# Altium project Studio_Clock_hv1.PrjPcb (part 2 of 3)

## Sheet Clock_7Segment.SchDoc
size A3; SheetNumber: 8; SheetTotal: 16
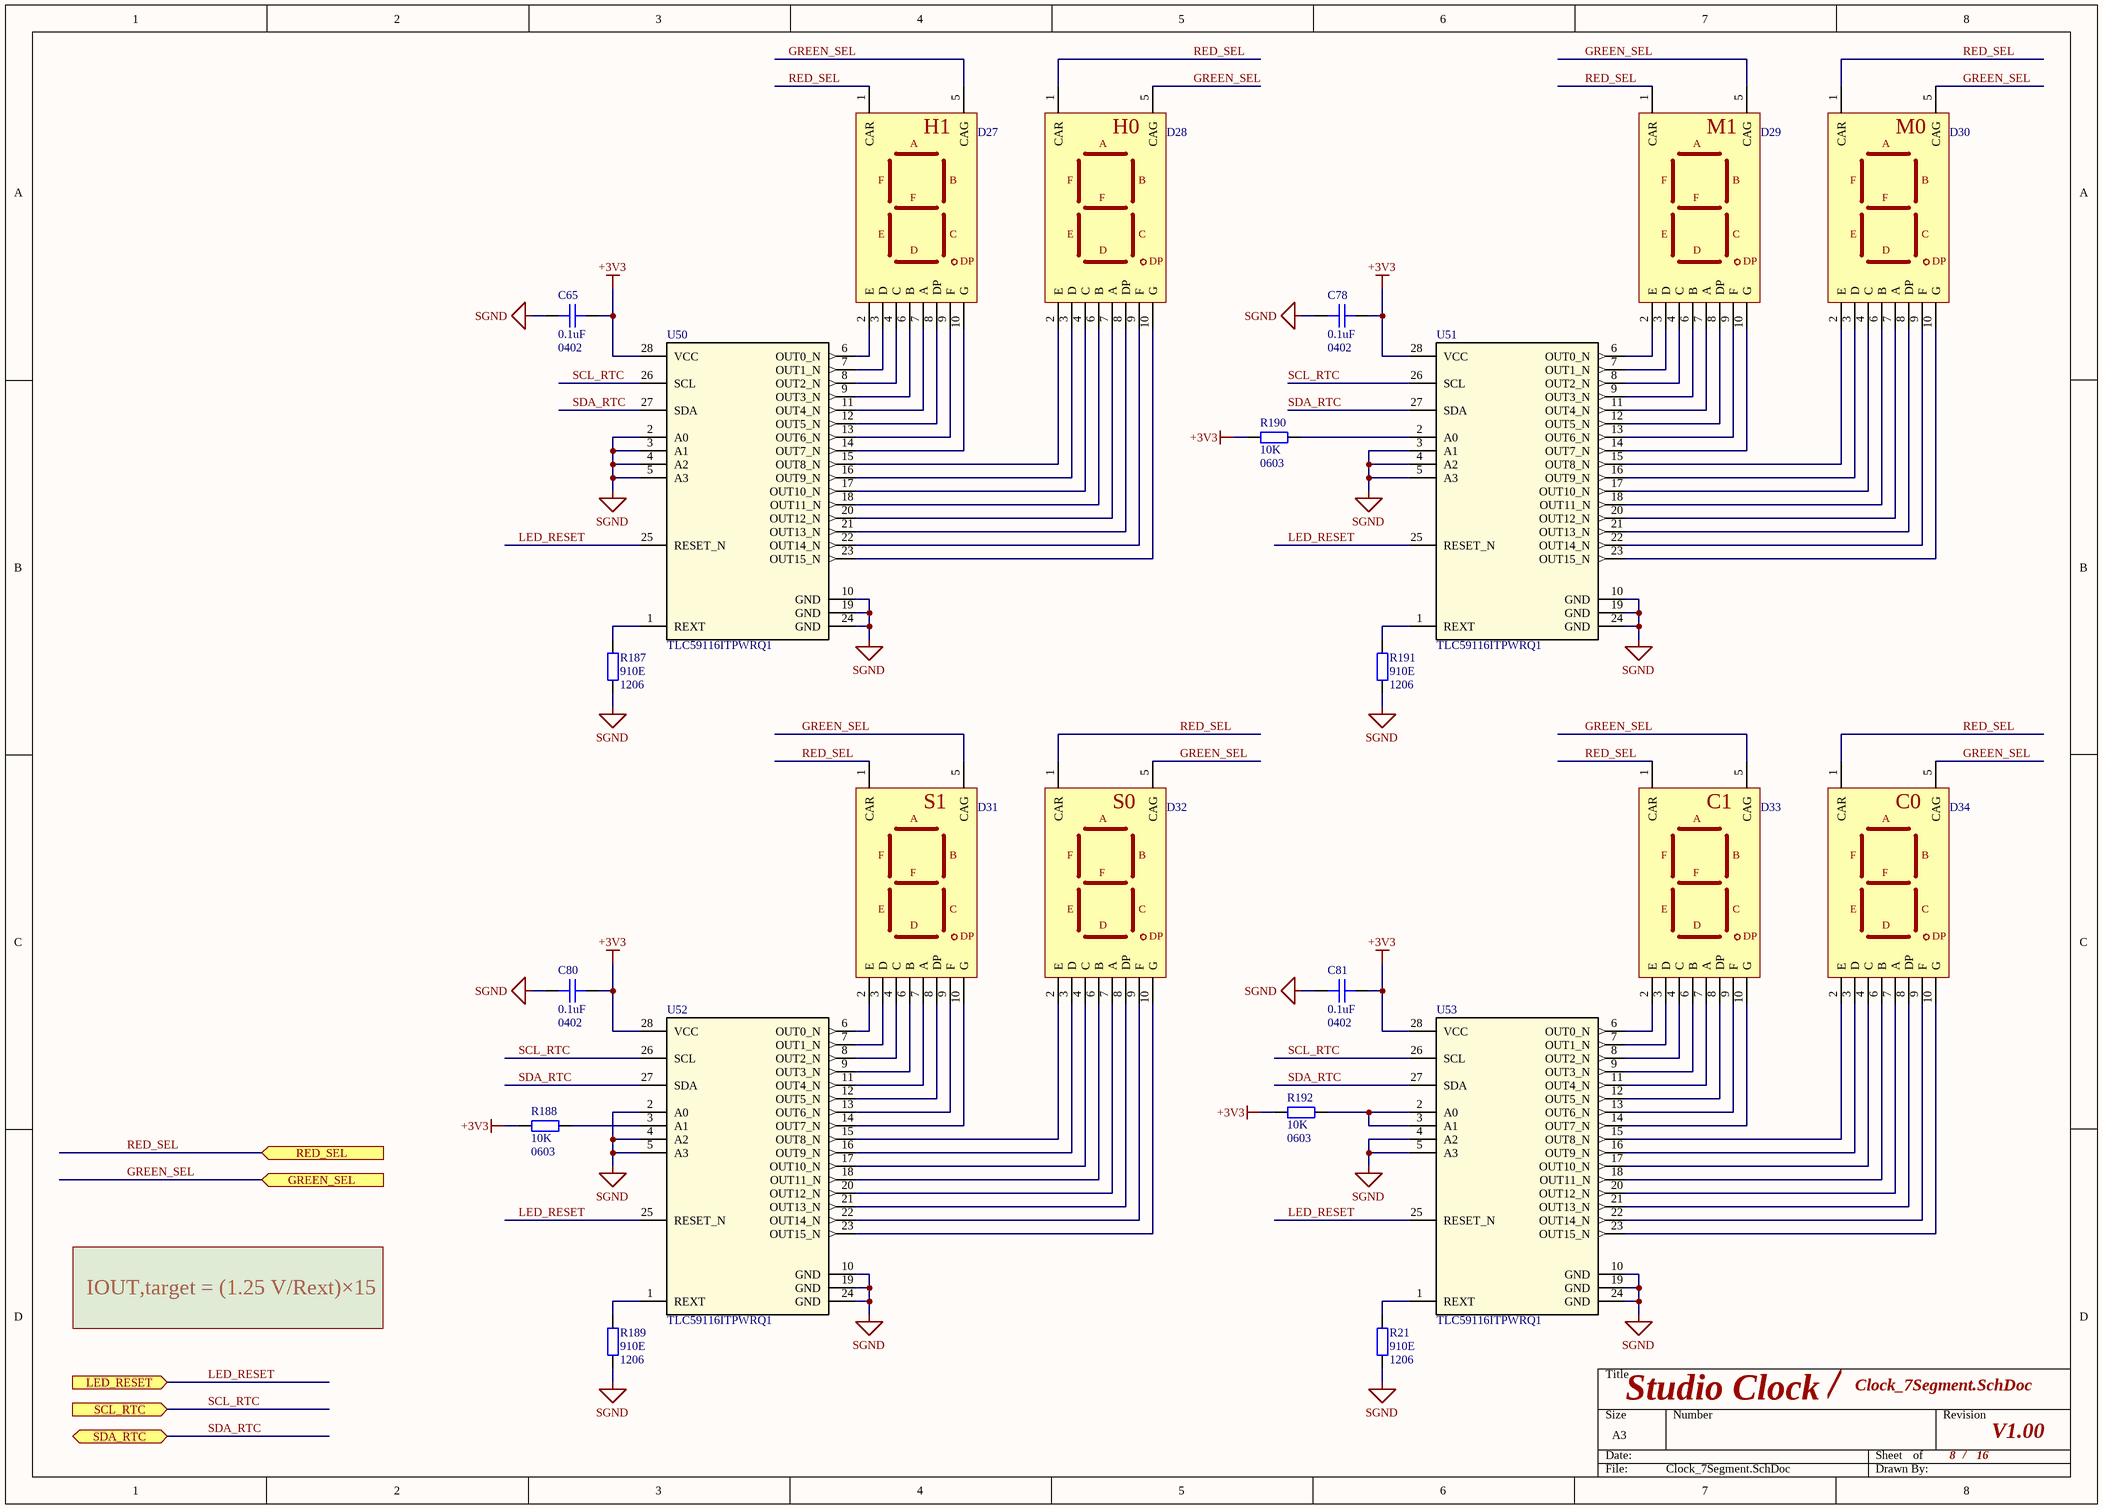
[diagram p7: Clock_7Segment.SchDoc]

### Parts
C65  Capacitance: 0.1uF  Package1: 0402  [CAPC100x50x50L25]  (hidden comment: 04023C104KAT2A)
C78  Capacitance: 0.1uF  Package1: 0402  [CAPC100x50x50L25]  (hidden comment: 04023C104KAT2A)
C80  Capacitance: 0.1uF  Package1: 0402  [CAPC100x50x50L25]  (hidden comment: 04023C104KAT2A)
C81  Capacitance: 0.1uF  Package1: 0402  [CAPC100x50x50L25]  (hidden comment: 04023C104KAT2A)
D27  KEM-15012-BSRSG  [7SEG_1.5inch]  (value not drawn)
D28  KEM-15012-BSRSG  [7SEG_1.5inch]  (value not drawn)
D29  KEM-15012-BSRSG  [7SEG_1.5inch]  (value not drawn)
D30  KEM-15012-BSRSG  [7SEG_1.5inch]  (value not drawn)
D31  KEM-15012-BSRSG  [7SEG_1.5inch]  (value not drawn)
D32  KEM-15012-BSRSG  [7SEG_1.5inch]  (value not drawn)
D33  KEM-15012-BSRSG  [7SEG_1.5inch]  (value not drawn)
D34  KEM-15012-BSRSG  [7SEG_1.5inch]  (value not drawn)
R21  Resistance: 910E  Size2: 1206  [RESC3116X06N]  (hidden comment: RC1206FR-10910RL)
R187  Resistance: 910E  Size2: 1206  [RESC3116X06N]  (hidden comment: RC1206FR-10910RL)
R188  Resistance: 10K  Size2: 0603  [RESC160X80X55L30]  (hidden comment: RC0603FR-0710KL)
R189  Resistance: 910E  Size2: 1206  [RESC3116X06N]  (hidden comment: RC1206FR-10910RL)
R190  Resistance: 10K  Size2: 0603  [RESC160X80X55L30]  (hidden comment: RC0603FR-0710KL)
R191  Resistance: 910E  Size2: 1206  [RESC3116X06N]  (hidden comment: RC1206FR-10910RL)
R192  Resistance: 10K  Size2: 0603  [RESC160X80X55L30]  (hidden comment: RC0603FR-0710KL)
U50  TLC59116ITPWRQ1  [PW0028A_N]
U51  TLC59116ITPWRQ1  [PW0028A_N]
U52  TLC59116ITPWRQ1  [PW0028A_N]
U53  TLC59116ITPWRQ1  [PW0028A_N]

### Ports
GREEN_SEL (in), LED_RESET (in), RED_SEL (in), SCL_RTC (in), SDA_RTC (bidir)

### Nets
+3V3: C65.1 C78.1 C80.1 C81.1 R188.2 R190.2 R192.2 U50.28(VCC) U51.28(VCC) U52.28(VCC) U53.28(VCC)
SGND: C65.2 C78.2 C80.2 C81.2 R21.1 R187.1 R189.1 R191.1 U50.2(A0) U50.3(A1) U50.4(A2) U50.5(A3) U50.10(GND) U50.19(GND) U50.24(GND) U51.3(A1) U51.4(A2) U51.5(A3) U51.10(GND) U51.19(GND) U51.24(GND) U52.2(A0) U52.4(A2) U52.5(A3) U52.10(GND) U52.19(GND) U52.24(GND) U53.4(A2) U53.5(A3) U53.10(GND) U53.19(GND) U53.24(GND)
GREEN_SEL: D27.5(CAG) D28.5(CAG) D29.5(CAG) D30.5(CAG) D31.5(CAG) D32.5(CAG) D33.5(CAG) D34.5(CAG) ; port GREEN_SEL
LED_RESET: U50.25(RESET_N) U51.25(RESET_N) U52.25(RESET_N) U53.25(RESET_N) ; port LED_RESET
RED_SEL: D27.1(CAR) D28.1(CAR) D29.1(CAR) D30.1(CAR) D31.1(CAR) D32.1(CAR) D33.1(CAR) D34.1(CAR) ; port RED_SEL
SCL_RTC: U50.26(SCL) U51.26(SCL) U52.26(SCL) U53.26(SCL) ; port SCL_RTC
SDA_RTC: U50.27(SDA) U51.27(SDA) U52.27(SDA) U53.27(SDA) ; port SDA_RTC
NetD27_2: D27.2(E) U50.6(OUT0_N)
NetD27_3: D27.3(D) U50.7(OUT1_N)
NetD27_4: D27.4(C) U50.8(OUT2_N)
NetD27_6: D27.6(B) U50.9(OUT3_N)
NetD27_7: D27.7(A) U50.11(OUT4_N)
NetD27_8: D27.8(DP) U50.12(OUT5_N)
NetD27_9: D27.9(F) U50.13(OUT6_N)
NetD27_10: D27.10(G) U50.14(OUT7_N)
NetD28_2: D28.2(E) U50.15(OUT8_N)
NetD28_3: D28.3(D) U50.16(OUT9_N)
NetD28_4: D28.4(C) U50.17(OUT10_N)
NetD28_6: D28.6(B) U50.18(OUT11_N)
NetD28_7: D28.7(A) U50.20(OUT12_N)
NetD28_8: D28.8(DP) U50.21(OUT13_N)
NetD28_9: D28.9(F) U50.22(OUT14_N)
NetD28_10: D28.10(G) U50.23(OUT15_N)
NetD29_2: D29.2(E) U51.6(OUT0_N)
NetD29_3: D29.3(D) U51.7(OUT1_N)
NetD29_4: D29.4(C) U51.8(OUT2_N)
NetD29_6: D29.6(B) U51.9(OUT3_N)
NetD29_7: D29.7(A) U51.11(OUT4_N)
NetD29_8: D29.8(DP) U51.12(OUT5_N)
NetD29_9: D29.9(F) U51.13(OUT6_N)
NetD29_10: D29.10(G) U51.14(OUT7_N)
NetD30_2: D30.2(E) U51.15(OUT8_N)
NetD30_3: D30.3(D) U51.16(OUT9_N)
NetD30_4: D30.4(C) U51.17(OUT10_N)
NetD30_6: D30.6(B) U51.18(OUT11_N)
NetD30_7: D30.7(A) U51.20(OUT12_N)
NetD30_8: D30.8(DP) U51.21(OUT13_N)
NetD30_9: D30.9(F) U51.22(OUT14_N)
NetD30_10: D30.10(G) U51.23(OUT15_N)
NetD31_2: D31.2(E) U52.6(OUT0_N)
NetD31_3: D31.3(D) U52.7(OUT1_N)
NetD31_4: D31.4(C) U52.8(OUT2_N)
NetD31_6: D31.6(B) U52.9(OUT3_N)
NetD31_7: D31.7(A) U52.11(OUT4_N)
NetD31_8: D31.8(DP) U52.12(OUT5_N)
NetD31_9: D31.9(F) U52.13(OUT6_N)
NetD31_10: D31.10(G) U52.14(OUT7_N)
NetD32_2: D32.2(E) U52.15(OUT8_N)
NetD32_3: D32.3(D) U52.16(OUT9_N)
NetD32_4: D32.4(C) U52.17(OUT10_N)
NetD32_6: D32.6(B) U52.18(OUT11_N)
NetD32_7: D32.7(A) U52.20(OUT12_N)
NetD32_8: D32.8(DP) U52.21(OUT13_N)
NetD32_9: D32.9(F) U52.22(OUT14_N)
NetD32_10: D32.10(G) U52.23(OUT15_N)
NetD33_2: D33.2(E) U53.6(OUT0_N)
NetD33_3: D33.3(D) U53.7(OUT1_N)
NetD33_4: D33.4(C) U53.8(OUT2_N)
NetD33_6: D33.6(B) U53.9(OUT3_N)
NetD33_7: D33.7(A) U53.11(OUT4_N)
NetD33_8: D33.8(DP) U53.12(OUT5_N)
NetD33_9: D33.9(F) U53.13(OUT6_N)
NetD33_10: D33.10(G) U53.14(OUT7_N)
NetD34_2: D34.2(E) U53.15(OUT8_N)
NetD34_3: D34.3(D) U53.16(OUT9_N)
NetD34_4: D34.4(C) U53.17(OUT10_N)
NetD34_6: D34.6(B) U53.18(OUT11_N)
NetD34_7: D34.7(A) U53.20(OUT12_N)
NetD34_8: D34.8(DP) U53.21(OUT13_N)
NetD34_9: D34.9(F) U53.22(OUT14_N)
NetD34_10: D34.10(G) U53.23(OUT15_N)
NetR21_2: R21.2 U53.1(REXT)
NetR187_2: R187.2 U50.1(REXT)
NetR188_1: R188.1 U52.3(A1)
NetR189_2: R189.2 U52.1(REXT)
NetR190_1: R190.1 U51.2(A0)
NetR191_2: R191.2 U51.1(REXT)
NetR192_1: R192.1 U53.2(A0) U53.3(A1)

### Notes on the sheet
- (near D27) H1
- (near D28) H0
- (near D29) M1
- (near D30) M0
- (near D31) S1
- (near D32) S0
- (near D33) C1
- (near D34) C0
- IOUT,target = (1.25 V/Rext)×15
- /

### Library data of the parts
C65 C78 C80 C81 = CMP-001-0374-4: 0402 25V X7R 100 NF 10%; Manufacturer: KYOCERA AVX; Op Temp max: 85°C; Op Temp min: -55°C; ComponentLink3URL: https://www.digikey.com/en/products/detail/yageo/CC0402MRX5R5BB106/5195138; MPN: 04023C104KAT2A; ComponentLink1URL: https://www.yageo.com/upload/media/product/productsearch/datasheet/mlcc/UPY-GPHC_X5R_4V-to-50V_26.pdf; Package: 0402 (1005 Metric); Size: 1.00mm x 0.50mm; Height max: 700µm; Mounting Type: SM; Tolerance: 10%; ComponentLink1Description: Datasheet; ComponentLink3Description: Digikey; Ratings: -; Dielectric: X7R; ComponentLink2Description: Mouser; ComponentLink2URL: https://eu.mouser.com/ProductDetail/YAGEO/CC0402MRX5R5BB106?qs=zEY9bCHj09eCmUJdZuS5Lg%3D%3D; Lead Spacing: 0mm; Component Type: Ceramic Capacitor; Voltage Rating: 25V
D27-D34 = 7SEG_Houkem-15012-BSRSG: 7 segment indicator; MPN: Houkem-15012-BSRSG
R21 R187 R189 R191 = RC_1206: RES 910 OHM 1% 1/4W 1206; MF: YAGEO; Power: 0.25W; Datasheet: https://www.yageo.com/upload/media/product/products/datasheet/rchip/PYu-RC_Group_51_RoHS_L_12.pdf; DigiKey: https://www.digikey.com/en/products/detail/yageo/RC1206FR-10910RL/14286762; Package: 1206 (3216 Metric); MPN: RC1206FR-10910RL
R188 R190 R192 = CMP-001-0628-7: as R135 on sheet SWITCH_CTRL1; Ratings: -; ComponentLink3URL: https://www.digikey.com/en/products/detail/yageo/RC0603FR-0710KL/726880?s=N4IgTCBcDaIEoGEAMA2JBmAYnAtEg7AIxIDSAMiALoC%2BQA; Size: 1.60mm x 0.80mm; ComponentLink1Description: Datasheet; ComponentLink3Description: Digikey; ComponentLink2Description: Mouser; ComponentLink1URL: https://www.yageo.com/upload/media/product/products/datasheet/rchip/PYu-RC_51_RoHS_P_4.pdf; Composition: Thick Film; Package: 0603 (1608 Metric); ComponentLink2URL: https://eu.mouser.com/ProductDetail/YAGEO/RC0603FR-0710KL?qs=grNVn54RoB%252B3GtjbJj3wJQ%3D%3D; Mounting Type: SM; Tolerance: 1%; Height max: 550µm; MPN: RC0603FR-0710KL; Component Type: Chip Resistor
U50-U53 = TLC59116ITPWRQ1: IC LED DRV LIN I2C 120MA 28TSSOP; Mfr_Name: Texas Instruments; Type: DEV; RefDes: RefDes; Copyright: Copyright (C) 2024 Ultra Librarian. All rights reserved.; MPN: TLC59116ITPWRQ1; ComponentLink1Description: Datasheet; ComponentLink1URL: https://www.ti.com/lit/ds/symlink/tlc59116-q1.pdf?ts=1707339950007&ref_url=https%253A%252F%252Fwww.ti.com%252Fproduct%252FTLC59116-Q1; ComponentLink2Description: DigiKey; ComponentLink2URL: https://www.digikey.com/en/products/detail/texas-instruments/tlc59116itpwrq1/6005364

## Sheet VIDEO_Interface.SchDoc
size A4; SheetNumber: 9; SheetTotal: 16
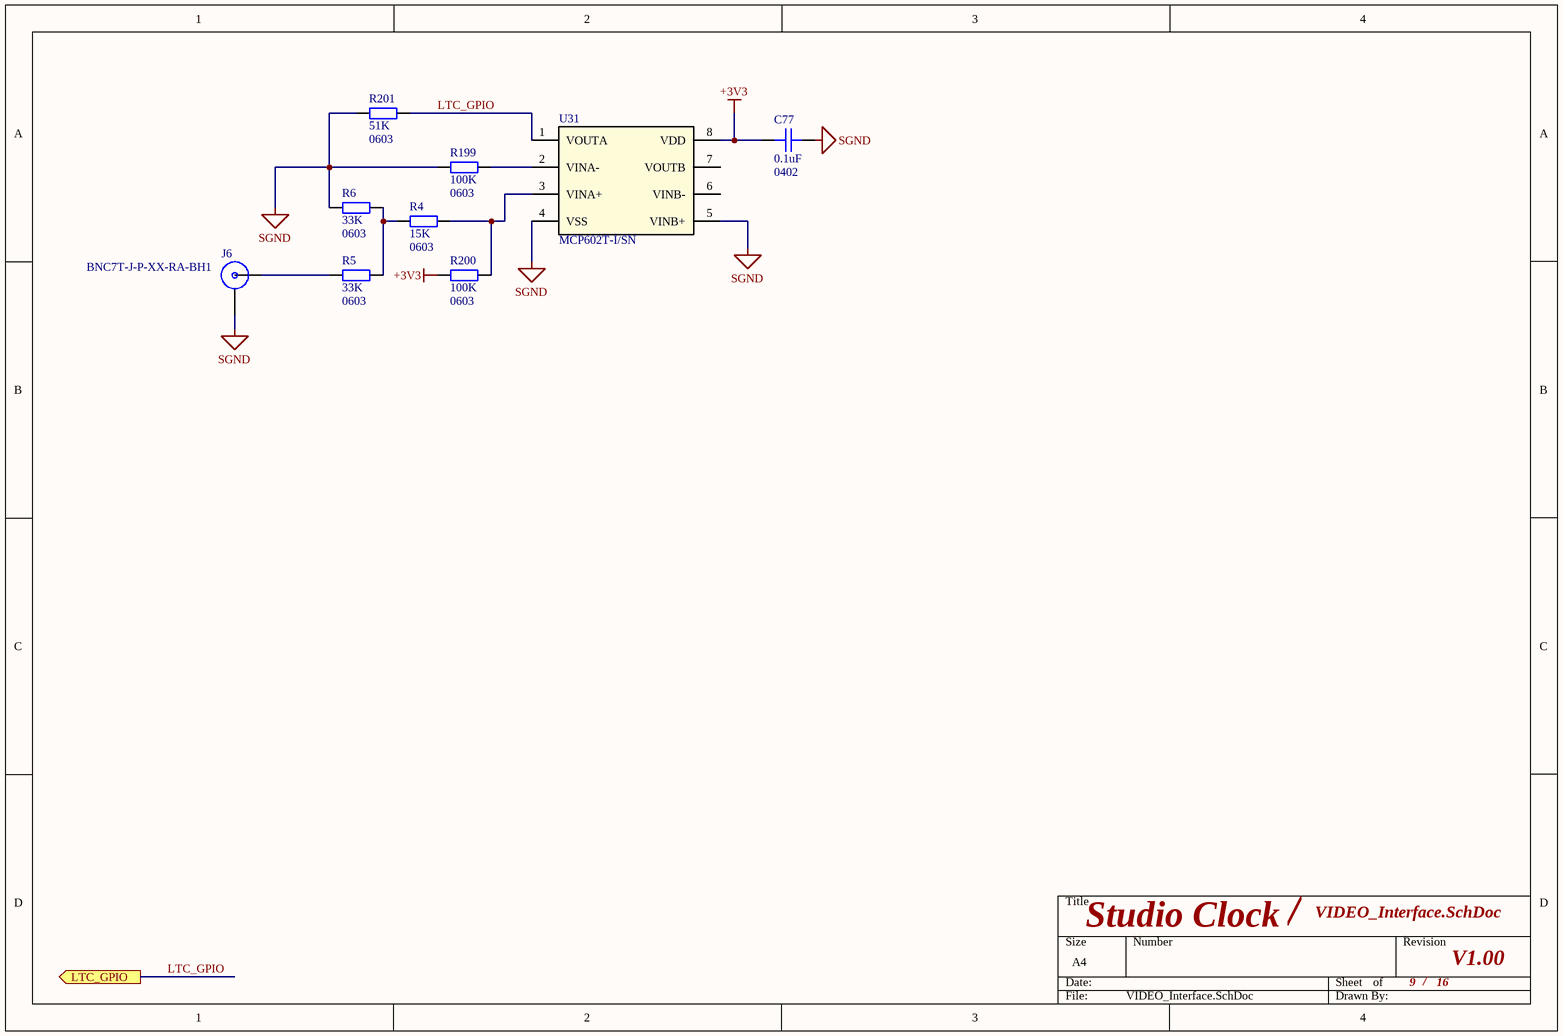
[diagram p8: VIDEO_Interface.SchDoc]

### Parts
C77  Capacitance: 0.1uF  Package1: 0402  [CAPC100x50x50L25]  (hidden comment: 04023C104KAT2A)
J6  BNC7T-J-P-XX-RA-BH1  [SAMTEC_BNC7T-J-P-XX-RA-BH1]
R4  Resistance: 15K  Size2: 0603  [RESC160X80X55L30]  (hidden comment: RC0603FR-0715KL)
R5  Resistance: 33K  Size2: 0603  [RESC160X80X55L30]  (hidden comment: RC0603FR-0733KL)
R6  Resistance: 33K  Size2: 0603  [RESC160X80X55L30]  (hidden comment: RC0603FR-0733KL)
R199  Resistance: 100K  Size2: 0603  [RESC160X80X55L30]  (hidden comment: RC0603FR-07100KL)
R200  Resistance: 100K  Size2: 0603  [RESC160X80X55L30]  (hidden comment: RC0603FR-07100KL)
R201  Resistance: 51K  Size2: 0603  [RESC160X80X55L30]  (hidden comment: RC0603FR-0751KP)
U31  MCP602T-I/SN  [SOIC8-N_MC_MCH]

### Ports
LTC_GPIO (out)

### Nets
+3V3: C77.2 R200.1 U31.8(VDD)
SGND: C77.1 J6.2 R6.1 R199.1 R201.2 U31.4(VSS) U31.5(VINB+)
LTC_GPIO: R201.1 U31.1(VOUTA) ; port LTC_GPIO
NetJ6_1: J6.1 R5.2
NetR4_1: R4.1 R5.1 R6.2
NetR4_2: R4.2 R200.2 U31.3(VINA+)
NetR199_2: R199.2 U31.2(VINA-)

Not connected (* = marked no-connect by the designer): U31 6(VINB-) 7(VOUTB)

### Notes on the sheet
- /

### Library data of the parts
C77 = CMP-001-0374-4: as C65 on sheet Clock_7Segment; ComponentLink3URL: https://www.digikey.com/en/products/detail/yageo/CC0402MRX5R5BB106/5195138; MPN: 04023C104KAT2A; ComponentLink1URL: https://www.yageo.com/upload/media/product/productsearch/datasheet/mlcc/UPY-GPHC_X5R_4V-to-50V_26.pdf; Package: 0402 (1005 Metric); Size: 1.00mm x 0.50mm; Height max: 700µm; Mounting Type: SM; Tolerance: 10%; ComponentLink1Description: Datasheet; ComponentLink3Description: Digikey; Ratings: -; Dielectric: X7R; ComponentLink2Description: Mouser; ComponentLink2URL: https://eu.mouser.com/ProductDetail/YAGEO/CC0402MRX5R5BB106?qs=zEY9bCHj09eCmUJdZuS5Lg%3D%3D; Lead Spacing: 0mm; Component Type: Ceramic Capacitor; Voltage Rating: 25V
J6 = BNC7T-J-P-XX-RA-BH1: CONN BNC JACK R/A 75 OHM PCB; MPN: BNC7T-J-P-HN-RA-BH1; MF: Samtec; Check_prices: https://www.snapeda.com/parts/BNC7T-J-P-HN-RA-BH1/Samtec+Inc./view-part/?ref=eda; Availability: In Stock; Price: None; Package: None; SnapEDA_Link: https://www.snapeda.com/parts/BNC7T-J-P-HN-RA-BH1/Samtec+Inc./view-part/?ref=snap; Purchase-URL: https://pricing.snapeda.com/search/part/BNC7T-J-P-HN-RA-BH1/?ref=eda; ComponentLink1Description: DigiKey; ComponentLink1URL: https://www.digikey.com/en/products/detail/samtec-inc/BNC7T-J-P-HN-RA-BH1/6642961; ComponentLink2Description: Datasheet; ComponentLink2URL: https://suddendocs.samtec.com/prints/bnc7t-j-p-xx-ra-bh1-mkt.pdf
R4 = CMP-001-0628-7: RES 15K OHM 1% 1/10W 0603; Manufacturer: YAGEO; Power: 100mW; Temperature Coefficient: ±100ppm; Op Temp max: 155°C; Op Temp min: -55°C; Ratings: -; ComponentLink3URL: https://www.digikey.com/en/products/detail/yageo/RC0603FR-0710KL/726880?s=N4IgTCBcDaIEoGEAMA2JBmAYnAtEg7AIxIDSAMiALoC%2BQA; Size: 1.60mm x 0.80mm; ComponentLink1Description: Datasheet; ComponentLink3Description: Digikey; ComponentLink2Description: Mouser; ComponentLink1URL: https://www.yageo.com/upload/media/product/products/datasheet/rchip/PYu-RC_51_RoHS_P_4.pdf; Composition: Thick Film; Package: 0603 (1608 Metric); ComponentLink2URL: https://eu.mouser.com/ProductDetail/YAGEO/RC0603FR-0710KL?qs=grNVn54RoB%252B3GtjbJj3wJQ%3D%3D; Mounting Type: SM; Tolerance: 1%; Height max: 550µm; MPN: RC0603FR-0715KL; Component Type: Chip Resistor
R5 R6 = CMP-001-0628-7: RES 33K OHM 1% 1/10W 0603; Manufacturer: YAGEO; Power: 100mW; Temperature Coefficient: ±100ppm; Op Temp max: 155°C; Op Temp min: -55°C; Ratings: -; ComponentLink3URL: https://www.digikey.com/en/products/detail/yageo/RC0603FR-0710KL/726880?s=N4IgTCBcDaIEoGEAMA2JBmAYnAtEg7AIxIDSAMiALoC%2BQA; Size: 1.60mm x 0.80mm; ComponentLink1Description: Datasheet; ComponentLink3Description: Digikey; ComponentLink2Description: Mouser; ComponentLink1URL: https://www.yageo.com/upload/media/product/products/datasheet/rchip/PYu-RC_51_RoHS_P_4.pdf; Composition: Thick Film; Package: 0603 (1608 Metric); ComponentLink2URL: https://eu.mouser.com/ProductDetail/YAGEO/RC0603FR-0710KL?qs=grNVn54RoB%252B3GtjbJj3wJQ%3D%3D; Mounting Type: SM; Tolerance: 1%; Height max: 550µm; MPN: RC0603FR-0733KL; Component Type: Chip Resistor
R199 R200 = CMP-001-0628-7: RES 100K OHM 1% 1/10W 0603; Manufacturer: YAGEO; Power: 100mW; Temperature Coefficient: ±100ppm; Op Temp max: 155°C; Op Temp min: -55°C; Ratings: -; ComponentLink3URL: https://www.digikey.com/en/products/detail/yageo/RC0603FR-0710KL/726880?s=N4IgTCBcDaIEoGEAMA2JBmAYnAtEg7AIxIDSAMiALoC%2BQA; Size: 1.60mm x 0.80mm; ComponentLink1Description: Datasheet; ComponentLink3Description: Digikey; ComponentLink2Description: Mouser; ComponentLink1URL: https://www.yageo.com/upload/media/product/products/datasheet/rchip/PYu-RC_51_RoHS_P_4.pdf; Composition: Thick Film; Package: 0603 (1608 Metric); ComponentLink2URL: https://eu.mouser.com/ProductDetail/YAGEO/RC0603FR-0710KL?qs=grNVn54RoB%252B3GtjbJj3wJQ%3D%3D; Mounting Type: SM; Tolerance: 1%; Height max: 550µm; MPN: RC0603FR-07100KL; Component Type: Chip Resistor
R201 = CMP-001-0628-7: RES 51K OHM 1% 1/10W 0603; Manufacturer: YAGEO; Power: 100mW; Temperature Coefficient: ±100ppm; Op Temp max: 155°C; Op Temp min: -55°C; Ratings: -; ComponentLink3URL: https://www.digikey.com/en/products/detail/yageo/RC0603FR-0710KL/726880?s=N4IgTCBcDaIEoGEAMA2JBmAYnAtEg7AIxIDSAMiALoC%2BQA; Size: 1.60mm x 0.80mm; ComponentLink1Description: Datasheet; ComponentLink3Description: Digikey; ComponentLink2Description: Mouser; ComponentLink1URL: https://www.yageo.com/upload/media/product/products/datasheet/rchip/PYu-RC_51_RoHS_P_4.pdf; Composition: Thick Film; Package: 0603 (1608 Metric); ComponentLink2URL: https://eu.mouser.com/ProductDetail/YAGEO/RC0603FR-0710KL?qs=grNVn54RoB%252B3GtjbJj3wJQ%3D%3D; Mounting Type: SM; Tolerance: 1%; Height max: 550µm; MPN: RC0603FR-0751KP; Component Type: Chip Resistor
U31 = MCP602T-ISN: No Description Available; Mfr_Name: Microchip; Copyright: Copyright (C) 2024 Ultra Librarian. All rights reserved.; MPN: MCP602T-I/SN; RefDes: RefDes; Type: DEV

## Sheet POE.SchDoc
size A4; SheetNumber: 12; SheetTotal: 16
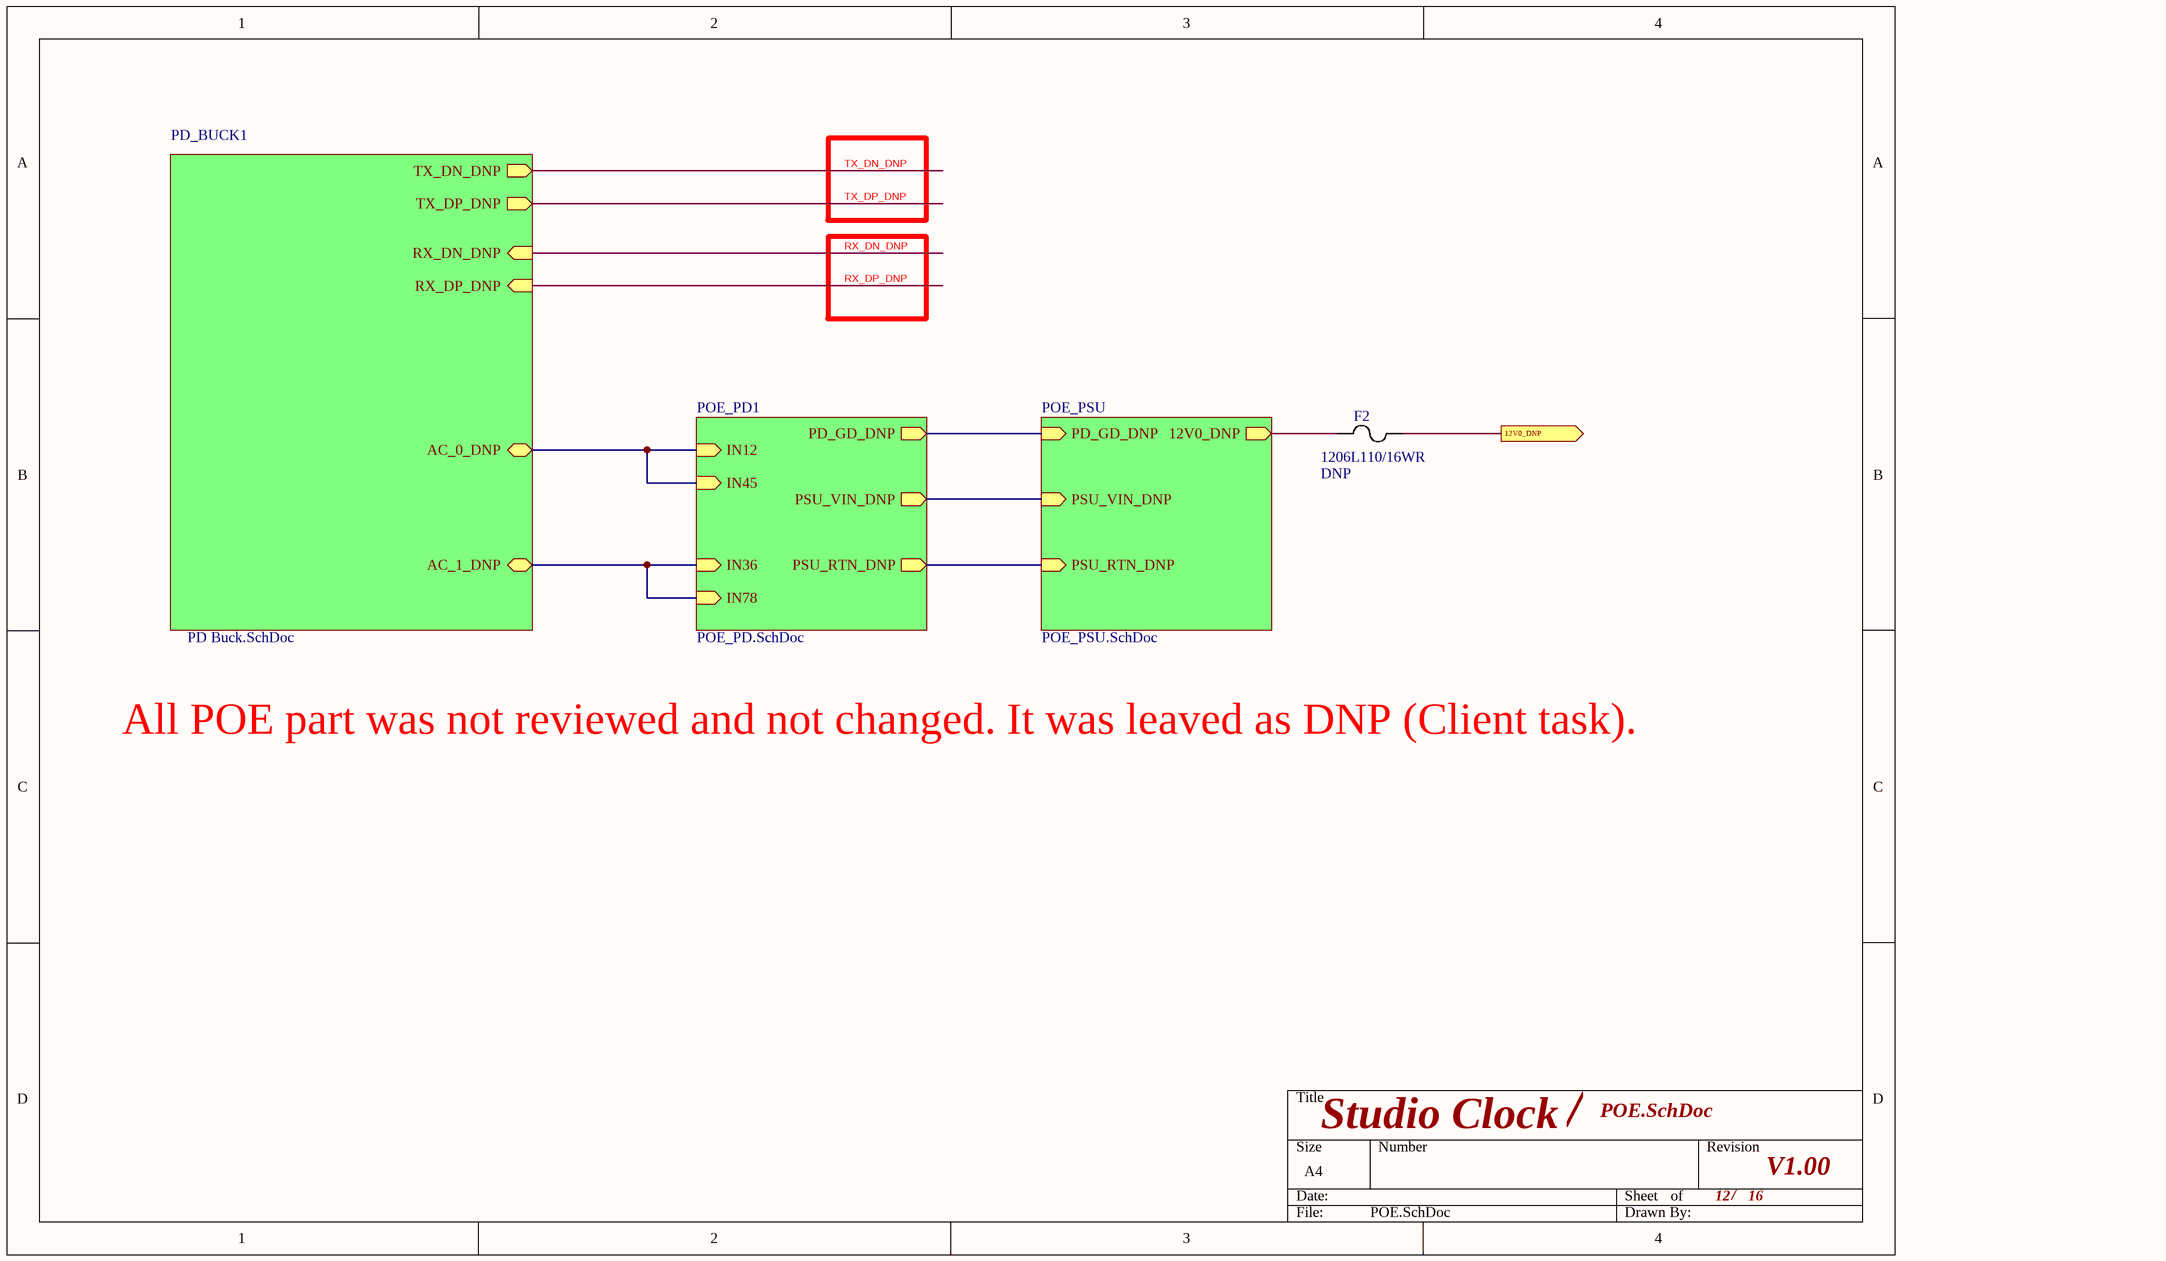
[diagram p9: POE.SchDoc]

### Parts
F2  1206L110/16WR  PMNT: DNP  [1206LSeries_LTF]

### Sub-sheets
PD_BUCK1 = PD Buck.SchDoc: AC_0_DNP (bidir), AC_1_DNP (bidir), RX_DP_DNP (in), RX_DN_DNP (in), TX_DN_DNP (out), TX_DP_DNP (out)
POE_PD1 = POE_PD.SchDoc: IN12 (in), IN36 (in), PD_GD_DNP (out), PSU_VIN_DNP (out), PSU_RTN_DNP (out), IN78 (in), IN45 (in)
POE_PSU = POE_PSU.SchDoc: PSU_RTN_DNP (in), PD_GD_DNP (in), PSU_VIN_DNP (in), 12V0_DNP (out)

### Ports
12V0_DNP (out)

### Nets
12V0_DNP: F2.2 ; port 12V0_DNP
RX_DN_DNP: sheet PD_BUCK1/RX_DN_DNP
RX_DP_DNP: sheet PD_BUCK1/RX_DP_DNP
TX_DN_DNP: sheet PD_BUCK1/TX_DN_DNP
TX_DP_DNP: sheet PD_BUCK1/TX_DP_DNP
NetF2_1: F2.1 ; sheet POE_PSU/12V0_DNP
(unnamed): sheet POE_PSU/PSU_RTN_DNP, sheet POE_PD1/PSU_RTN_DNP
(unnamed): sheet POE_PSU/PD_GD_DNP, sheet POE_PD1/PD_GD_DNP
(unnamed): sheet POE_PSU/PSU_VIN_DNP, sheet POE_PD1/PSU_VIN_DNP
(unnamed): sheet POE_PD1/IN12, sheet POE_PD1/IN45, sheet PD_BUCK1/AC_0_DNP
(unnamed): sheet POE_PD1/IN36, sheet POE_PD1/IN78, sheet PD_BUCK1/AC_1_DNP

### Notes on the sheet
- All POE part was not reviewed and not changed. It was leaved as DNP (Client task).
- /

### Library data of the parts
F2 = 1206L05015YR: PTC RESET FUSE 16V 1.1A 1206; Mfr_Name: Littelfuse Inc; Current - Trip (It): 2.2 A; Resistance - Initial (Ri) (Min): 40 mOhms; Voltage - Max: 16 V; MPN: 1206L110/16WR; Current - Hold (Ih) (Max): 1.1 A; ComponentLink1Description: DigiKey; ComponentLink1URL: https://www.digikey.com/en/products/detail/littelfuse-inc/1206L110-16WR/3997167?s=N4IgTCBcDaIIxgAwDYAyc6IPR2SAugL5A

## Sheet POE_PSU.SchDoc
size A3; SheetNumber: 15; SheetTotal: 16
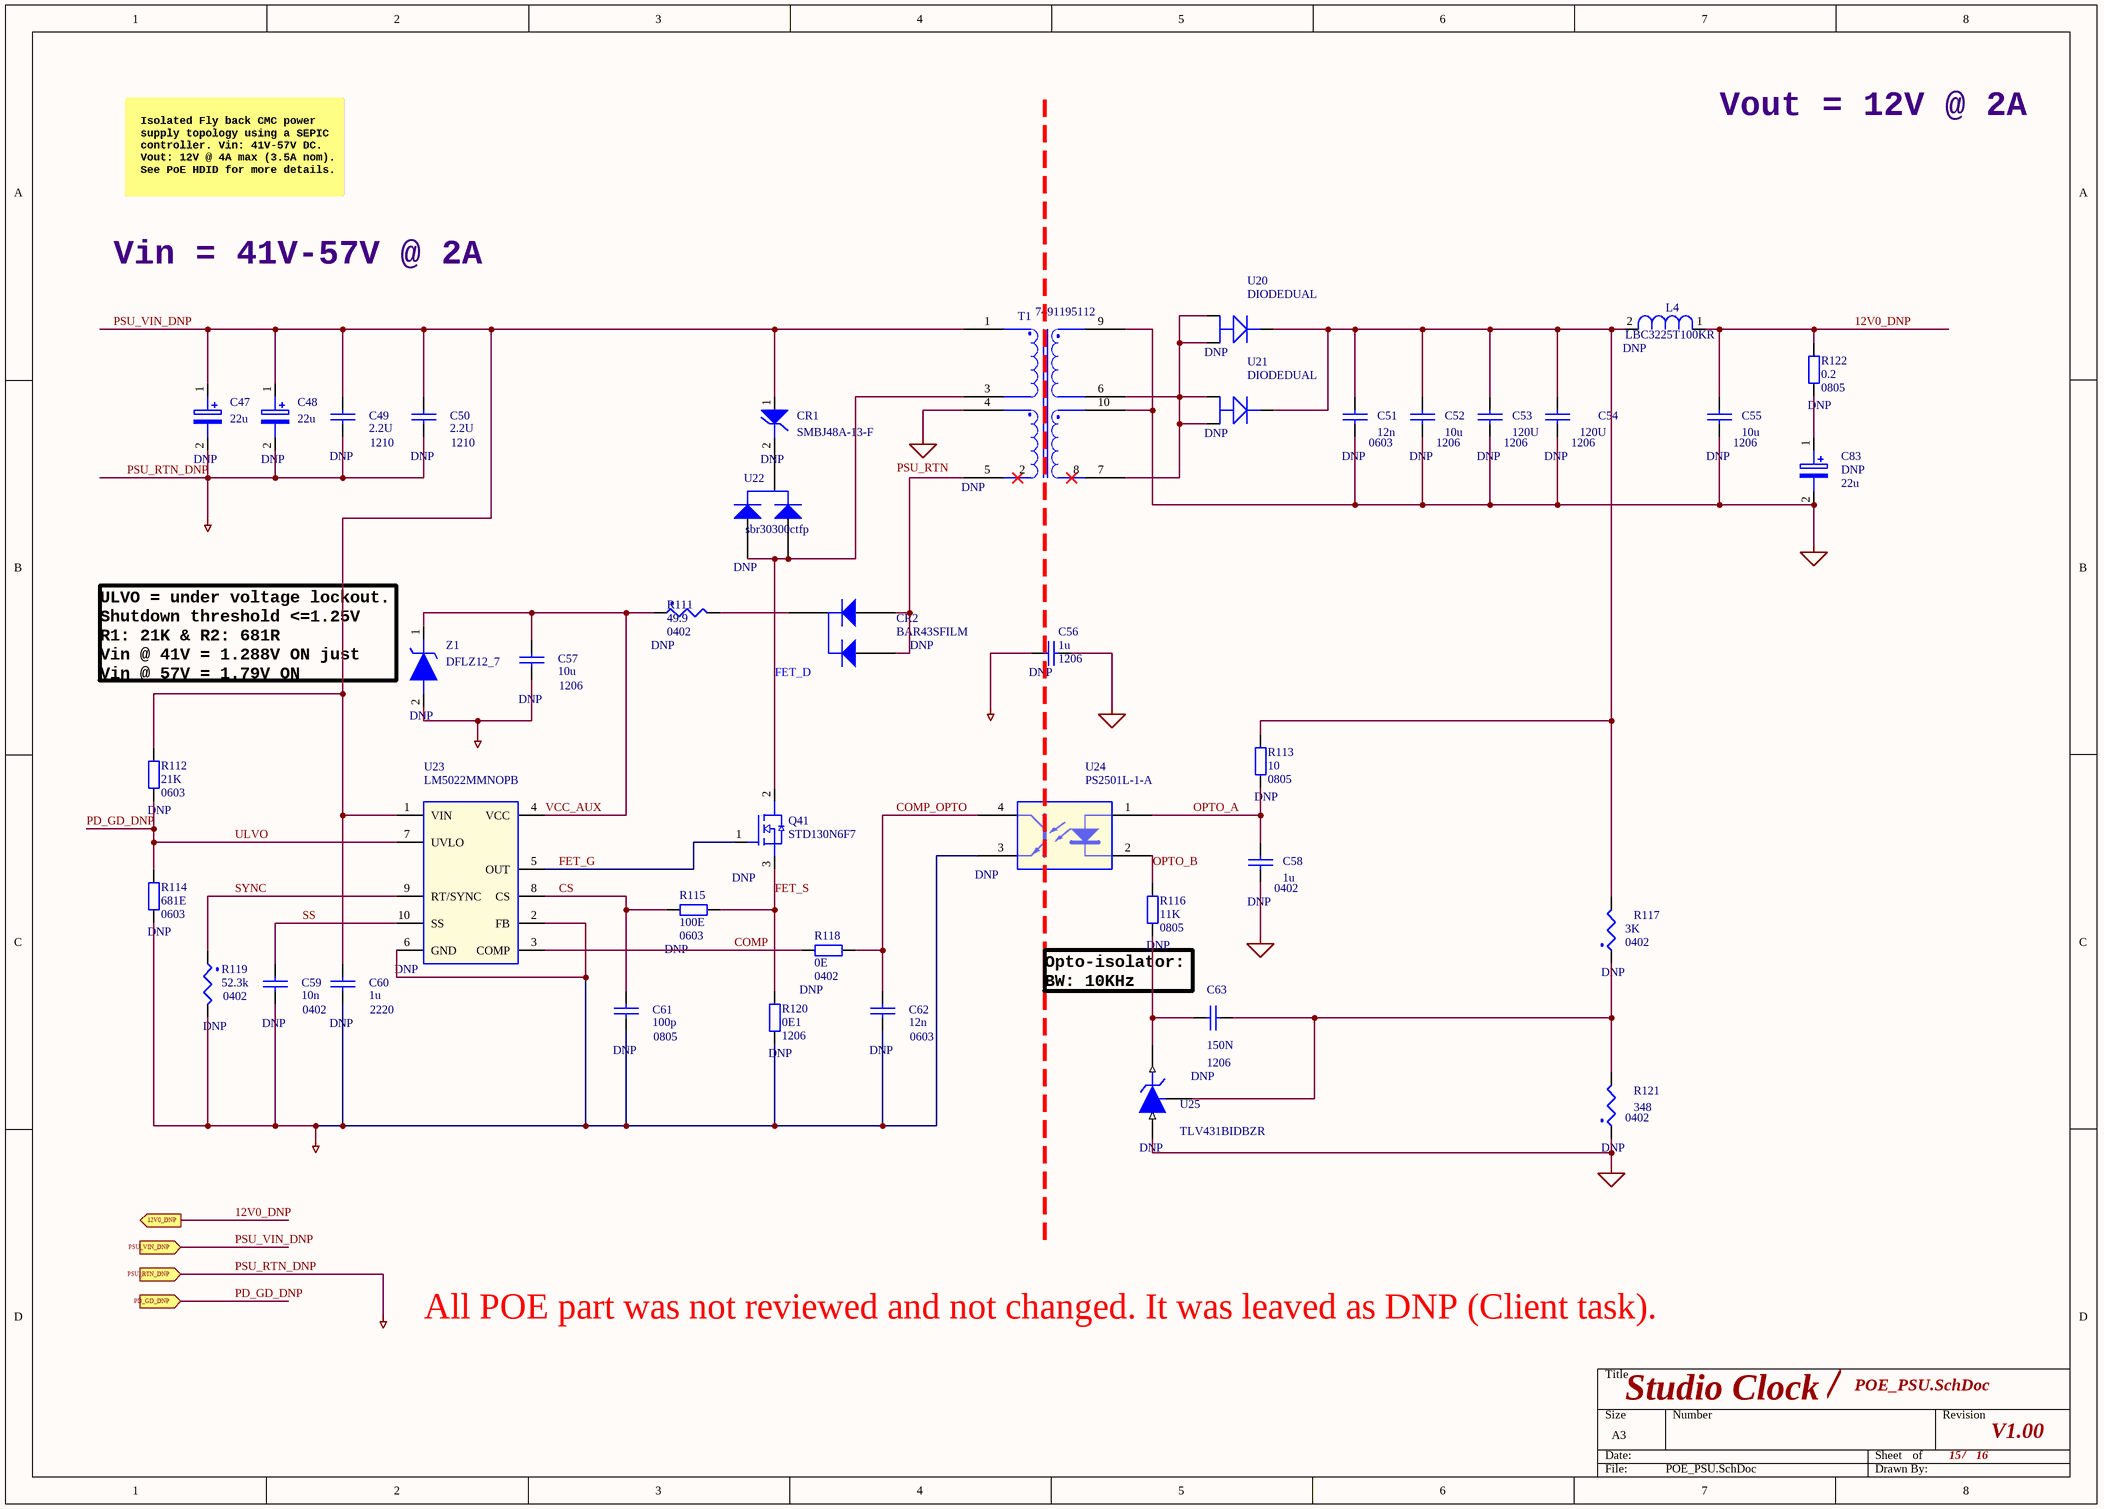
[diagram p10: POE_PSU.SchDoc]

### Parts
C47  22u  [CAPAE830X550N]
C48  22u  [CAPAE830X550N]
C49  2.2U  Foot Print Type: 1210  [cap_sm_1210]
C50  2.2U  Foot Print Type: 1210  [cap_sm_1210]
C51  12n  Foot Print Type: 0603  [c_cs_0603]
C52  10u  Foot Print Type: 1206  [cap_sm_1206]
C53  120U  Foot Print Type: 1206  [cap_sm_1206]
C54  120U  Foot Print Type: 1206  [cap_sm_1206]
C55  10u  Foot Print Type: 1206  [cap_sm_1206]
C56  1u  Foot Print Type: 1206  [cap_sm_1206]
C57  10u  Foot Print Type: 1206  [cap_sm_1206]
C58  1u  Foot Print Type: 0402  [c_np_0402]
C59  10n  Foot Print Type: 0402  [c_np_0402]
C60  1u  Foot Print Type: 2220  [cap_sm_2220]
C61  100p  Foot Print Type: 0805  [cap_sm_0805]
C62  12n  Foot Print Type: 0603  [c_cs_0603]
C63  150N  Foot Print Type: 1206  [cap_sm_1206]
C83  22u  [CAPAE830X550N]
CR1  SMBJ48A-13-F  [SMB_DIO]
CR2  BAR43SFILM  [SOT23-3L_STM]
L4  LBC3225T100KR  [IND_TAIYO_LBC3225_TAY]
Q41  STD130N6F7  [DPAK228P987X240-3N]
R111  49.9  Foot Print Size: 0402  [r_sm_0402_r]
R112  Resistance: 21K  SIZE2: 0603  [RESC160X80X55L30]
R113  Resistance: 10  Size2: 0805  [RESC200X125X60L40]
R114  Resistance: 681E  Package: 0603  [RESC160X80X55L30]
R115  Resistance: 100E  Size2: 0603  [RESC160X80X55L30]
R116  Resistance: 11K  Size2: 0805  [RESC200X125X60L40]
R117  3K  Foot Print Size: 0402  [r_sm_0402_r]
R118  Resistance: 0E  Size2: 0402  [RESC100X50X40L25]  (hidden comment: AC0402JR-070RL)
R119  52.3k  Foot Print Size: 0402  [r_sm_0402_r]
R120  Resistance: 0E1  Size2: 1206  [RESC3116X06N]  (hidden comment: RL1206FR-070R1L)
R121  348  Foot Print Size: 0402  [r_sm_0402_r]
R122  Resistance: 0.2  Size2: 0805  [RESC200X125X60L40]
T1  7491195112  [7491195112]
U20  DIODEDUAL  [D2PAK_STM]
U21  DIODEDUAL  [D2PAK_STM]
U22  sbr30300ctfp  [TO254P995X450X1960-3]
U23  LM5022MMNOPB  [SOP50P490X110-10N]
U24  PS2501L-1-A  [DIP-4_REN]
U25  TLV431BIDBZR  [SOT95P237X112-3N]
Z1  DFLZ12_7  [DFLZ127]

### Ports
12V0_DNP (out), PD_GD_DNP (in), PSU_RTN_DNP (in), PSU_VIN_DNP (in)

### Nets
GND_SIGNAL: C51.1 C52.1 C53.1 C54.1 C55.1 C56.2 C58.1 C83.2(M) R121.1 T1.9 T1.10 U25.3(ANODE)
PSU_RTN: T1.4
PSU_RTN_DNP: C47.2(M) C48.2(M) C49.2 C50.2 C56.1 C57.2 C59.2 C60.2 C61.2 C62.2 R114.2 R119.2 R120.1 U23.2(FB) U23.6(GND) U24.3(EMITTER) Z1.2(A) ; port PSU_RTN_DNP  [also labelled 1]
12V0_DNP: C55.2 L4.1 R122.2 ; port 12V0_DNP
COMP: R118.1 U23.3(COMP)
COMP_OPTO: C62.1 R118.2 U24.4(COLLECTOR)
CS: C61.1 R115.2 U23.8(CS)
FET_D: Q41.2(D__1) T1.3 U22.1 U22.3
FET_G: Q41.1(D) U23.5(OUT)
FET_S: Q41.3(G) R115.1 R120.2
OPTO_A: C58.2 R113.1 U24.1(ANODE)
OPTO_B: R116.2 U24.2(CATHODE)
PD_GD_DNP: R112.2 R114.1 U23.7(UVLO) ; port PD_GD_DNP  [also labelled ULVO]
PSU_VIN_DNP: C47.1(P) C48.1(P) C49.1 C50.1 C60.1 CR1.1 R112.1 T1.1 U23.1(VIN) ; port PSU_VIN_DNP
SS: C59.1 U23.10(SS)
SYNC: R119.1 U23.9(RT/SYNC)
VCC_AUX: C57.1 R111.1 U23.4(VCC) Z1.1(K)
NetC51_2: C51.2 C52.2 C53.2 C54.2 L4.2 R113.2 R117.2 U20.3 U21.3
NetC63_1: C63.1 R116.1 U25.2(CATHODE)
NetC63_2: C63.2 R117.1 R121.2 U25.1(REF)
NetC83_1: C83.1(P) R122.1
NetCR1_2: CR1.2 U22.2
NetCR2_1: CR2.1(A2) CR2.3(A1/K2) T1.5
NetCR2_2: CR2.2(K1) R111.2
NetT1_6: T1.6 T1.7 U20.1 U20.2 U21.1 U21.2

Not connected (* = marked no-connect by the designer): T1 2* 8*

### Notes on the sheet
- Isolated Fly back CMC power
  supply topology using a SEPIC
  controller. Vin: 41V-57V DC.
  Vout: 12V @ 4A max (3.5A nom).
  See PoE HDID for more details.
- Vout = 12V @ 2A
- Vin = 41V-57V @ 2A
- (near Z1) ULVO = under voltage lockout.
  Shutdown threshold <=1.25V
  R1: 21K & R2: 681R
  Vin @ 41V = 1.288V ON just
  Vin @ 57V = 1.79V ON
- Opto-isolator:
  BW: 10KHz
- All POE part was not reviewed and not changed. It was leaved as DNP (Client task).
- /

### Library data of the parts
C47 C48 = UWX1H220MCL1GB: Nichicon 22uF 50 V Aluminium Electrolytic Capacitor SMD, WX Series 2000h 8 (Dia.) x 5.4mm; OriginalSymbolOrigin: (0,0); PCB Footprint: cap_sm_1210; DeviceNumbering: Alpha; DeviceDesignator: A; DevicesInPackage: 1; IsHeterogeneous: False; Voltage: 50V; Tollerance: 5%; Height: 5.5 mm; Datasheet Link: http://www.nichicon.co.jp/english/products/pdfs/e-uwx.pdf; Arrow Price/Stock: https://www.arrow.com/en/products/uwx1h220mcl1gb/nichicon; Arrow Part Number: UWX1H220MCL1GB; Mouser Part Number: 647-UWX1H220MCL1; Manufacturer_Part_Number: UWX1H220MCL1GB; Manufacturer_Name: Nichicon; DevicesInView: 1; PackageName: UWX1H220MCL1GB; DNP: DNP
C49-C58 = CAP_NP: CLASS: DISCRETE; Voltage: 50V; Tollerance: 5%; DNP: DNP
  C49 C50: PCB Footprint: cap_sm_1210
  C51: PCB Footprint: c_cs_0603
  C52-C57: PCB Footprint: cap_sm_1206
  C58: PCB Footprint: c_np_0402
C59-C63 = CAP_NP: CLASS: DISCRETE; Voltage: 50V; Tollerance: 1%; DNP: DNP
  C59: PCB Footprint: c_np_0402
  C60: PCB Footprint: cap_sm_2220
  C61: PCB Footprint: cap_sm_0805
  C62: PCB Footprint: c_cs_0603
  C63: PCB Footprint: cap_sm_1206
C83 = UWX1H220MCL1GB: Nichicon 22uF 50 V Aluminium Electrolytic Capacitor SMD, WX Series 2000h 8 (Dia.) x 5.4mm; OriginalSymbolOrigin: (0,0); PCB Footprint: cap_sm_0805; DeviceNumbering: Alpha; DeviceDesignator: A; DevicesInPackage: 1; IsHeterogeneous: False; Tollerance: 5%; Voltage: 50V; Height: 5.5 mm; Datasheet Link: http://www.nichicon.co.jp/english/products/pdfs/e-uwx.pdf; Arrow Price/Stock: https://www.arrow.com/en/products/uwx1h220mcl1gb/nichicon; Arrow Part Number: UWX1H220MCL1GB; Mouser Part Number: 647-UWX1H220MCL1; Manufacturer_Part_Number: UWX1H220MCL1GB; Manufacturer_Name: Nichicon; DevicesInView: 1; PackageName: UWX1H220MCL1GB; DNP: DNP
CR1 = SMBJ48A-13-F: Mfr_Name: Diodes Inc; Copyright: Copyright (C) 2022 Ultra Librarian. All rights reserved.; Manufacturer_Part_Number: SMBJ48A-13-F; PCB Footprint: SMB_DIO; DNP: DNP
CR2 = BAR43SFILM: Mfr_Name: STMicroelectronics; Manufacturer_Part_Number: BAR43SFILM; Copyright: Copyright (C) 2022 Ultra Librarian. All rights reserved.; PCB Footprint: SOT23-3L_STM; DNP: DNP
L4 = LBC3225T100KR: Mfr_Name: Taiyo Yuden; Manufacturer_Part_Number: 74437324010; PCB Footprint: IND_74437324010; Copyright: Copyright (C) 2022 Ultra Librarian. All rights reserved.; DNP: DNP
R111 R121 = SMD_RESISTOR: Voltage: 50V; Tollerance: 0.1%; PCB Footprint: r_sm_0402_r; DNP: DNP
R112 = CMP-001-0628-7: RES 21K OHM 1/10W 0603; Power: 100mW; Temperature Coefficient: ±100ppm; Op Temp max: 155°C; Op Temp min: -55°C; Ratings: -; Size: 1.60mm x 0.80mm; Composition: Thick Film; Package: 0603 (1608 Metric); Mounting Type: SM; Height max: 550µm; Component Type: Chip Resistor; DNP: DNP
R113 = CMP-001-0694-4: RES 10 OHM 1% 1/8W 0805; Manufacturer: YAGEO; Temperature Coefficient: ±100ppm; Power: 125mW; Op Temp min: -55°C; Op Temp max: 155°C; Package: 0805 (2012 Metric); Size: 2.00mm x 1.25mm; ComponentLink1Description: Datasheet; ComponentLink3Description: Digikey; ComponentLink2URL: https://eu.mouser.com/ProductDetail/YAGEO/RC0805FR-0727RL?qs=fRxXYNj8ftGXrQSQGs8%252BUg%3D%3D; Mounting Type: SM; Composition: Thick Film; ComponentLink3URL: https://www.digikey.com/en/products/detail/yageo/RC0805FR-0727RL/727779; Tolerance: 1%; Height max: 600µm; ComponentLink2Description: Mouser; Ratings: -; ComponentLink1URL: https://www.yageo.com/upload/media/product/productsearch/datasheet/rchip/PYu-RC_Group_51_RoHS_L_12.pdf; Component Type: Chip Resistor; DNP: DNP
R114 = CMP-001-0628-7: RES 681 OHM 1/10W 0603; Power: 100mW; Temperature Coefficient: ±100ppm; Op Temp max: 155°C; Op Temp min: -55°C; Ratings: -; Size: 1.60mm x 0.80mm; Composition: Thick Film; Mounting Type: SM; Height max: 550µm; Component Type: Chip Resistor; DNP: DNP
R115 = CMP-001-0628-7: RES 100 OHM 1/10W 0603; Power: 100mW; Temperature Coefficient: ±100ppm; Op Temp max: 155°C; Op Temp min: -55°C; Ratings: -; Size: 1.60mm x 0.80mm; Composition: Thick Film; Package: 0603 (1608 Metric); Mounting Type: SM; Height max: 550µm; Component Type: Chip Resistor; DNP: DNP
R116 = CMP-001-0694-4: RES 11K OHM 1% 1/8W 0805; Manufacturer: YAGEO; Temperature Coefficient: ±100ppm; Power: 125mW; Op Temp min: -55°C; Op Temp max: 155°C; Package: 0805 (2012 Metric); Size: 2.00mm x 1.25mm; ComponentLink1Description: Datasheet; ComponentLink3Description: Digikey; ComponentLink2URL: https://eu.mouser.com/ProductDetail/YAGEO/RC0805FR-0727RL?qs=fRxXYNj8ftGXrQSQGs8%252BUg%3D%3D; Mounting Type: SM; Composition: Thick Film; ComponentLink3URL: https://www.digikey.com/en/products/detail/yageo/RC0805FR-0727RL/727779; Tolerance: 1%; Height max: 600µm; ComponentLink2Description: Mouser; Ratings: -; ComponentLink1URL: https://www.yageo.com/upload/media/product/productsearch/datasheet/rchip/PYu-RC_Group_51_RoHS_L_12.pdf; Component Type: Chip Resistor; DNP: DNP
R117 R119 = SMD_RESISTOR: Tollerance: 1%; Voltage: 50V; PCB Footprint: r_sm_0402_r; DNP: DNP
R118 = CMP-001-0484-6: as R128 on sheet Q_Light_CTRL1; ComponentLink3URL: https://www.digikey.com/en/products/detail/yageo/RC0402FR-0727RL/5280946; ComponentLink2Description: Mouser; Ratings: -; Tolerance: Jumper; Height max: 400µm; MPN: AC0402JR-070RL; ComponentLink1URL: https://www.yageo.com/upload/media/product/productsearch/datasheet/rchip/PYu-RC_Group_51_RoHS_L_12.pdf; Size: 1.00mm x 0.50mm; Composition: Thick Film; Package: 0402 (1005 Metric); ComponentLink3Description: Digikey; Mounting Type: SM; ComponentLink2URL: https://eu.mouser.com/ProductDetail/YAGEO/RC0402FR-0727RL?qs=UOUeRUa%252B8Wlb37UyFHw9Bw%3D%3D; ComponentLink1Description: Datasheet; Component Type: Chip Resistor; DNP: DNP
R120 = RC_1206: RES 0.1 OHM 1% 1/4W 1206; MF: YAGEO; Power: 0.25W; Datasheet: https://www.yageo.com/upload/media/product/products/datasheet/rchip/PYu-RC_Group_51_RoHS_L_12.pdf; DigiKey: https://www.digikey.com/en/products/detail/yageo/RC1206JR-070RL/729184; Package: 1206 (3216 Metric); MPN: RL1206FR-070R1L; DNP: DNP
R122 = CMP-001-0694-4: RES 0.2 OHM 1% 1/8W 0805; Manufacturer: YAGEO; Temperature Coefficient: ±100ppm; Power: 125mW; Op Temp min: -55°C; Op Temp max: 155°C; Package: 0805 (2012 Metric); Size: 2.00mm x 1.25mm; ComponentLink1Description: Datasheet; ComponentLink3Description: Digikey; ComponentLink2URL: https://eu.mouser.com/ProductDetail/YAGEO/RC0805FR-0727RL?qs=fRxXYNj8ftGXrQSQGs8%252BUg%3D%3D; Mounting Type: SM; Composition: Thick Film; ComponentLink3URL: https://www.digikey.com/en/products/detail/yageo/RC0805FR-0727RL/727779; Tolerance: 1%; Height max: 600µm; ComponentLink2Description: Mouser; Ratings: -; ComponentLink1URL: https://www.yageo.com/upload/media/product/productsearch/datasheet/rchip/PYu-RC_Group_51_RoHS_L_12.pdf; Component Type: Chip Resistor; DNP: DNP
U20 U21 = STPS20M100SG-TR: Mfr_Name: STMicroelectronics; Copyright: Copyright (C) 2022 Ultra Librarian. All rights reserved.; Manufacturer_Part_Number: STPS20M100SG-TR; PCB Footprint: D2PAK_STM; DNP: DNP
U23 = LM5022MMNOPB: OriginalSymbolOrigin: (-50000,70000); PCB Footprint: SOP50P490X110-10N; DNP: DNP
U24 = PS2501-1-A: Mfr_Name: Renesas Electronics; PCB Footprint: SOIC_1L-1-A; Copyright: Copyright (C) 2022 Ultra Librarian. All rights reserved.; Manufacturer_Part_Number: PS2501L-1-A; DNP: DNP
U25 = TLV431BIDBZR: OriginalSymbolOrigin: (-70000,20000); PCB Footprint: SOT95P237X112-3N; DNP: DNP
Z1 = DFLZ12_7: Zener Diodes; Manufacturer_Part_Number: DFLZ12-7; Manufacturer_Name: Diodes Inc.; OriginalSymbolOrigin: (0,0); DeviceNumbering: Alpha; DeviceDesignator: A; DevicesInPackage: 1; IsHeterogeneous: False; Height: 1 mm; Datasheet Link: https://ms.componentsearchengine.com/Datasheets/1/DFLZ12-7.pdf; Arrow Price/Stock: https://www.arrow.com/en/products/dflz12-7/diodes-incorporated?region=nac; Arrow Part Number: DFLZ12-7; Mouser Part Number: 621-DFLZ12-7; PCB Footprint: DFLZ127; DevicesInView: 1; PackageName: DFLZ12_7; DNP: DNP
Q41 = STD130N6F7: PCB Footprint: DPAK228P987X240-3N; DNP: DNP
T1 = 7491195112: PCB Footprint: 7491195112; DNP: DNP
U22 = sbr30300ctfp: PCB Footprint: TO254P995X450X1960-3; DNP: DNP

## Sheet POE_PD.SchDoc
size A3; SheetNumber: 14; SheetTotal: 16
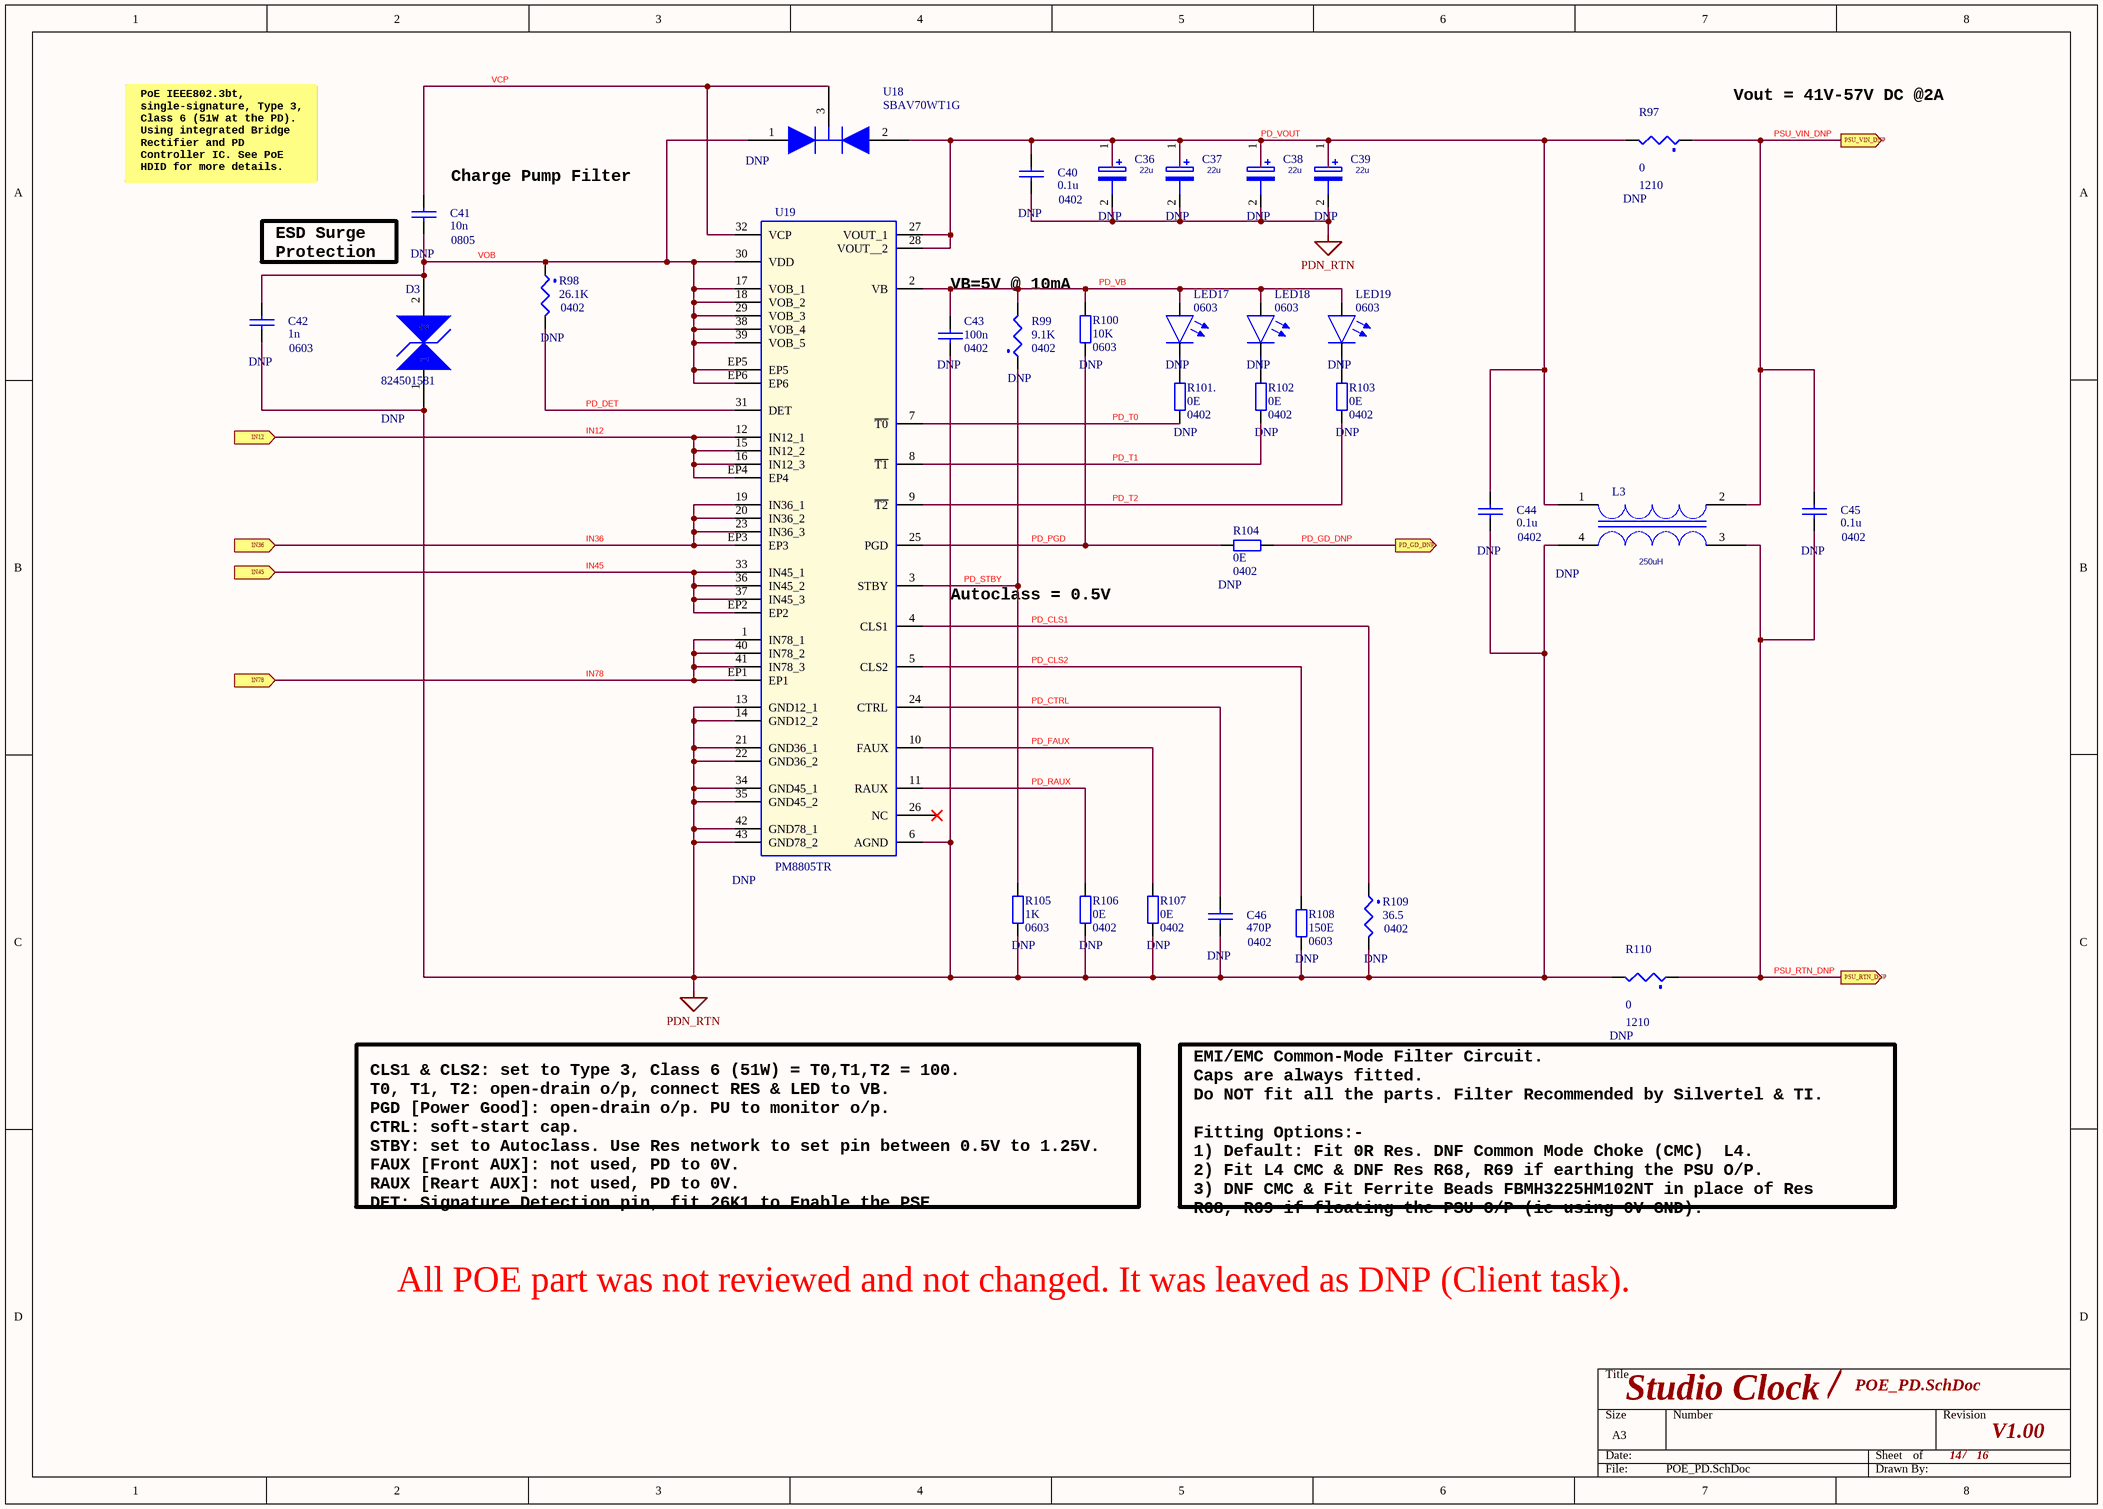
[diagram p11: POE_PD.SchDoc]

### Parts
C36  CAP_V: 22u  [CAPAE830X550N]  (hidden comment: UWX1H220MCL1GB)
C37  CAP_V: 22u  [CAPAE830X550N]  (hidden comment: UWX1H220MCL1GB)
C38  CAP_V: 22u  [CAPAE830X550N]  (hidden comment: UWX1H220MCL1GB)
C39  CAP_V: 22u  [CAPAE830X550N]  (hidden comment: UWX1H220MCL1GB)
C40  0.1u  Foot Print Type: 0402  [c_np_0402]
C41  10n  Foot Print Type: 0805  [cap_sm_0805]
C42  1n  Foot Print Type: 0603  [c_cs_0603]
C43  100n  Foot Print Type: 0402  [c_np_0402]
C44  0.1u  Foot Print Type: 0402  [c_np_0402]
C45  0.1u  Foot Print Type: 0402  [c_np_0402]
C46  470P  Foot Print Type: 0402  [c_np_0402]
D3  824501581  [824501581]
L3  INDUCTANCE: 250uH  [744272251]  (hidden comment: 744272251)
LED17  Size: 0603  [LED_0603(1608)]  (hidden comment: 150060GS75000)
LED18  Size: 0603  [LED_0603(1608)]  (hidden comment: 150060GS75000)
LED19  Size: 0603  [LED_0603(1608)]  (hidden comment: 150060GS75000)
R97  0  Foot Print Size: 1210  [r_sm_1210]
R98  26.1K  Foot Print Size: 0402  [r_sm_0402_r]
R99  9.1K  Foot Print Size: 0402  [r_sm_0402_r]
R100  Resistance: 10K  Size2: 0603  [RESC160X80X55L30]  (hidden comment: RC0603FR-0710KL)
R101.  Resistance: 0E  Size2: 0402  [RESC100X50X40L25]  (hidden comment: AC0402JR-071KL)
R102  Resistance: 0E  Size2: 0402  [RESC100X50X40L25]  (hidden comment: AC0402JR-071KL)
R103  Resistance: 0E  Size2: 0402  [RESC100X50X40L25]  (hidden comment: AC0402JR-071KL)
R104  Resistance: 0E  Size2: 0402  [RESC100X50X40L25]  (hidden comment: AC0402JR-070RL)
R105  Resistance: 1K  Size2: 0603  [RESC160X80X55L30]  (hidden comment: RC0603FR-071KL)
R106  Resistance: 0E  Size2: 0402  [RESC100X50X40L25]  (hidden comment: AC0402JR-070RL)
R107  Resistance: 0E  Size2: 0402  [RESC100X50X40L25]  (hidden comment: AC0402JR-070RL)
R108  Resistance: 150E  Size2: 0603  [RESC160X80X55L30]  (hidden comment: RC0603JR-07150RL)
R109  36.5  Foot Print Size: 0402  [r_sm_0402_r]
R110  0  Foot Print Size: 1210  [r_sm_1210]
U18  SBAV70WT1G  [SOT-323-3_2P2X1P35_ONS]
U19  PM8805TR  [XCVR_PM8805TR]

### Ports
IN12 (in), IN36 (in), IN45 (in), IN78 (in), PD_GD_DNP (out), PSU_RTN_DNP (out), PSU_VIN_DNP (out)

### Nets
PDN_RTN: C36.2(M) C37.2(M) C38.2(M) C39.2(M) C40.2 C42.2 C43.2 C44.2 C46.2 D3.1 L3.4 R105.2 R106.2 R107.2 R108.2 R109.2 R110.2 U19.6(AGND) U19.13(GND12_1) U19.14(GND12_2) U19.21(GND36_1) U19.22(GND36_2) U19.34(GND45_1) U19.35(GND45_2) U19.42(GND78_1) U19.43(GND78_2)
PSU_RTN_DNP: C45.2 L3.3 R110.1 ; port PSU_RTN_DNP
IN12: U19.12(IN12_1) U19.15(IN12_2) U19.16(IN12_3) U19.EP4 ; port IN12
IN36: U19.19(IN36_1) U19.20(IN36_2) U19.23(IN36_3) U19.EP3 ; port IN36
IN45: U19.33(IN45_1) U19.36(IN45_2) U19.37(IN45_3) U19.EP2 ; port IN45
IN78: U19.1(IN78_1) U19.40(IN78_2) U19.41(IN78_3) U19.EP1 ; port IN78
PD_CLS1: R109.1 U19.4(CLS1)
PD_CLS2: R108.1 U19.5(CLS2)
PD_CTRL: C46.1 U19.24(CTRL)
PD_DET: R98.2 U19.31(DET)
PD_FAUX: R107.1 U19.10(FAUX)
PD_GD_DNP: R104.2 ; port PD_GD_DNP
PD_PGD: R100.2 R104.1 U19.25(PGD)
PD_RAUX: R106.1 U19.11(RAUX)
PD_STBY: R99.1 R105.1 U19.3(STBY)
PD_T0: R101..1 U19.7(~{T0})
PD_T1: R102.1 U19.8(~{T1})
PD_T2: R103.1 U19.9(~{T2})
PD_VB: C43.1 LED17.1(Anode) LED18.1(Anode) LED19.1(Anode) R99.2 R100.1 U19.2(VB)
PD_VOUT: C36.1(P) C37.1(P) C38.1(P) C39.1(P) C40.1 C44.1 L3.1 R97.2 U18.2(ANODE_1) U19.27(VOUT_1) U19.28(VOUT__2)
PSU_VIN_DNP: C45.1 L3.2 R97.1 ; port PSU_VIN_DNP
VCP: C41.1 U18.3(CATHODE) U19.32(VCP)
VOB: C41.2 C42.1 D3.2 R98.1 U18.1(ANODE) U19.17(VOB_1) U19.18(VOB_2) U19.29(VOB_3) U19.30(VDD) U19.38(VOB_4) U19.39(VOB_5) U19.EP5 U19.EP6
NetLED17_2: LED17.2(Chatode) R101..2
NetLED18_2: LED18.2(Chatode) R102.2
NetLED19_2: LED19.2(Chatode) R103.2

Not connected (* = marked no-connect by the designer): U19 26(NC)*

### Notes on the sheet
- Vout = 41V-57V DC @2A
- PoE IEEE802.3bt,
  single-signature, Type 3,
  Class 6 (51W at the PD).
  Using integrated Bridge
  Rectifier and PD
  Controller IC. See PoE
  HDID for more details.
- (near C41) Charge Pump Filter
- (near C41) ESD Surge
  Protection
- VB=5V @ 10mA
- Autoclass = 0.5V
- CLS1 & CLS2: set to Type 3, Class 6 (51W) = T0,T1,T2 = 100.
  T0, T1, T2: open-drain o/p, connect RES & LED to VB.
  PGD [Power Good]: open-drain o/p. PU to monitor o/p.
  CTRL: soft-start cap.
  STBY: set to Autoclass. Use Res network to set pin between 0.5V to 1.25V.
  FAUX [Front AUX]: not used, PD to 0V.
  RAUX [Reart AUX]: not used, PD to 0V.
  DET: Signature Detection pin, fit 26K1 to Enable the PSE.
- EMI/EMC Common-Mode Filter Circuit.
  Caps are always fitted.
  Do NOT fit all the parts. Filter Recommended by Silvertel & TI.
  Fitting Options:-
  1) Default: Fit 0R Res. DNF Common Mode Choke (CMC)  L4.
  2) Fit L4 CMC & DNF Res R68, R69 if earthing the PSU O/P.
  3) DNF CMC & Fit Ferrite Beads FBMH3225HM102NT in place of Res
  R68, R69 if floating the PSU O/P (ie using 0V GND).
- All POE part was not reviewed and not changed. It was leaved as DNP (Client task).
- /

### Library data of the parts
C36-C39 = UWX1H220MCL1GB: Nichicon 22uF 50 V Aluminium Electrolytic Capacitor SMD, WX Series 2000h 8 (Dia.) x 5.4mm; OriginalSymbolOrigin: (0,0); PCB Footprint: cap_sm_1210; DeviceNumbering: Alpha; DeviceDesignator: A; DevicesInPackage: 1; IsHeterogeneous: False; Voltage: 65V; Tollerance: 5%; Height: 5.5 mm; Datasheet Link: http://www.nichicon.co.jp/english/products/pdfs/e-uwx.pdf; Arrow Price/Stock: https://www.arrow.com/en/products/uwx1h220mcl1gb/nichicon; Arrow Part Number: UWX1H220MCL1GB; Mouser Part Number: 647-UWX1H220MCL1; Manufacturer_Part_Number: UWX1H220MCL1GB; Manufacturer_Name: Nichicon; DevicesInView: 1; PackageName: UWX1H220MCL1GB; DNP: DNP
C40 = CAP_NP: CLASS: DISCRETE; Tollerance: 5%; Voltage: 50V; PCB Footprint: c_np_0402; DNP: DNP
C41 = CAP_NP: CLASS: DISCRETE; Tollerance: 1%; Voltage: 50V; PCB Footprint: cap_sm_0805; DNP: DNP
C42 C46 = CAP_NP: CLASS: DISCRETE; Voltage: 50V; Tollerance: 1%; DNP: DNP
  C42: PCB Footprint: c_cs_0603
  C46: PCB Footprint: c_np_0402
C43 = CAP_NP: CLASS: DISCRETE; PCB Footprint: c_np_0402; DNP: DNP
C44 C45 = CAP_NP: CLASS: DISCRETE; Voltage: 50V; Tollerance: 5%; PCB Footprint: c_np_0402; DNP: DNP
LED17-LED19 = LED_0603_SMD: LED GREEN CLEAR 0603 SMD; MPN: 150060GS75000; ComponentLink1Description: DigiKey; ComponentLink1URL: https://www.digikey.com/en/products/detail/w%C3%BCrth-elektronik/150060gs75000/4489898; DNP: DNP
R97 = SMD_RESISTOR: Voltage: 50V; Tollerance: 5%; PCB Footprint: r_sm_1210; DNP: DNP
R98 R99 = SMD_RESISTOR: Tollerance: 1%; Voltage: 50V; PCB Footprint: r_sm_0402_r; DNP: DNP
R100 = CMP-001-0628-7: RES 10K OHM 1% 1/10W 0603; Manufacturer: YAGEO; Power: 100mW; Temperature Coefficient: ±100ppm; Op Temp max: 155°C; Op Temp min: -55°C; PMNT: DNP; Ratings: -; ComponentLink3URL: https://www.digikey.com/en/products/detail/yageo/RC0603FR-0710KL/726880?s=N4IgTCBcDaIEoGEAMA2JBmAYnAtEg7AIxIDSAMiALoC%2BQA; Size: 1.60mm x 0.80mm; ComponentLink1Description: Datasheet; ComponentLink3Description: Digikey; ComponentLink2Description: Mouser; ComponentLink1URL: https://www.yageo.com/upload/media/product/products/datasheet/rchip/PYu-RC_51_RoHS_P_4.pdf; Composition: Thick Film; Package: 0603 (1608 Metric); ComponentLink2URL: https://eu.mouser.com/ProductDetail/YAGEO/RC0603FR-0710KL?qs=grNVn54RoB%252B3GtjbJj3wJQ%3D%3D; Mounting Type: SM; Tolerance: 1%; Height max: 550µm; MPN: RC0603FR-0710KL; Component Type: Chip Resistor; DNP: DNP
R101. R102 R103 = CMP-001-0484-6: RES SMD 1K OHM 1/16W 0402; Manufacturer: YAGEO; Power: 63mW; Op Temp min: -55°C; Temperature Coefficient: ±100ppm; Op Temp max: 155°C; ComponentLink3URL: https://www.digikey.com/en/products/detail/yageo/ac0402jr-071kl/5895603; Ratings: -; Height max: 400µm; MPN: AC0402JR-071KL; Size: 1.00mm x 0.50mm; Composition: Thick Film; Package: 0402 (1005 Metric); ComponentLink3Description: Digikey; Mounting Type: SM; Component Type: Chip Resistor; DNP: DNP
R104 R106 R107 = CMP-001-0484-6: RES SMD 0 OHM JUMPER 1/16W 0402; Manufacturer: YAGEO; Power: 63mW; Op Temp min: -55°C; Temperature Coefficient: ±100ppm; Op Temp max: 155°C; ComponentLink3URL: https://www.digikey.com/en/products/detail/yageo/RC0402FR-0727RL/5280946; ComponentLink2Description: Mouser; Ratings: -; Tolerance: Jumper; Height max: 400µm; MPN: AC0402JR-070RL; ComponentLink1URL: https://www.yageo.com/upload/media/product/productsearch/datasheet/rchip/PYu-RC_Group_51_RoHS_L_12.pdf; Size: 1.00mm x 0.50mm; Composition: Thick Film; Package: 0402 (1005 Metric); ComponentLink3Description: Digikey; Mounting Type: SM; ComponentLink2URL: https://eu.mouser.com/ProductDetail/YAGEO/RC0402FR-0727RL?qs=UOUeRUa%252B8Wlb37UyFHw9Bw%3D%3D; ComponentLink1Description: Datasheet; Component Type: Chip Resistor; DNP: DNP
R105 = CMP-001-0628-7: RES 1K OHM 1% 1/10W 0603; Manufacturer: YAGEO; Power: 100mW; Temperature Coefficient: ±100ppm; Op Temp max: 155°C; Op Temp min: -55°C; Ratings: -; ComponentLink3URL: https://www.digikey.com/en/products/detail/yageo/RC0603FR-0710KL/726880?s=N4IgTCBcDaIEoGEAMA2JBmAYnAtEg7AIxIDSAMiALoC%2BQA; Size: 1.60mm x 0.80mm; ComponentLink1Description: Datasheet; ComponentLink3Description: Digikey; ComponentLink1URL: https://www.digikey.ee/en/products/detail/yageo/rc0603fr-07100rp/4935304; Composition: Thick Film; Package: 0603 (1608 Metric); Mounting Type: SM; Tolerance: 1%; Height max: 550µm; MPN: RC0603FR-071KL; Component Type: Chip Resistor; DNP: DNP
R108 = CMP-001-0628-7: RES 150 OHM 5% 1/10W 0603; Manufacturer: YAGEO; Power: 100mW; Temperature Coefficient: ±100ppm; Tolerance: 1%; Op Temp max: 155°C; Op Temp min: -55°C; Ratings: -; ComponentLink3URL: https://www.digikey.com/en/products/detail/yageo/RC0603FR-0710KL/726880?s=N4IgTCBcDaIEoGEAMA2JBmAYnAtEg7AIxIDSAMiALoC%2BQA; Size: 1.60mm x 0.80mm; ComponentLink1Description: Datasheet; ComponentLink3Description: Digikey; ComponentLink2Description: Mouser; ComponentLink1URL: https://www.yageo.com/upload/media/product/products/datasheet/rchip/PYu-RC_51_RoHS_P_4.pdf; Composition: Thick Film; Package: 0603 (1608 Metric); ComponentLink2URL: https://eu.mouser.com/ProductDetail/YAGEO/RC0603FR-0710KL?qs=grNVn54RoB%252B3GtjbJj3wJQ%3D%3D; Mounting Type: SM; Height max: 550µm; MPN: RC0603JR-07150RL; Component Type: Chip Resistor; DNP: DNP
R109 = SMD_RESISTOR: Voltage: 50V; Tollerance: 0.5%; PCB Footprint: r_sm_0402_r; DNP: DNP
R110 = SMD_RESISTOR: Tollerance: 5%; Voltage: 50V; PCB Footprint: r_sm_1210; DNP: DNP
U18 = SBAV70WT1G: Mfr_Name: onsemi; Manufacturer_Part_Number: SBAV70WT1G; Copyright: Copyright (C) 2022 Ultra Librarian. All rights reserved.; PCB Footprint: SOT-323-3_2P2X1P35_ONS; DNP: DNP
U19 = PM8805TR: OriginalSymbolOrigin: (-50000,170000); PCB Footprint: XCVR_PM8805TR; DNP: DNP
D3 = 824501581: PCB Footprint: 824501581; DNP: DNP
L3 = 744272251: PCB Footprint: 744272251; DNP: DNP

## Sheet PD Buck.SchDoc
size A3; SheetNumber: 13; SheetTotal: 16
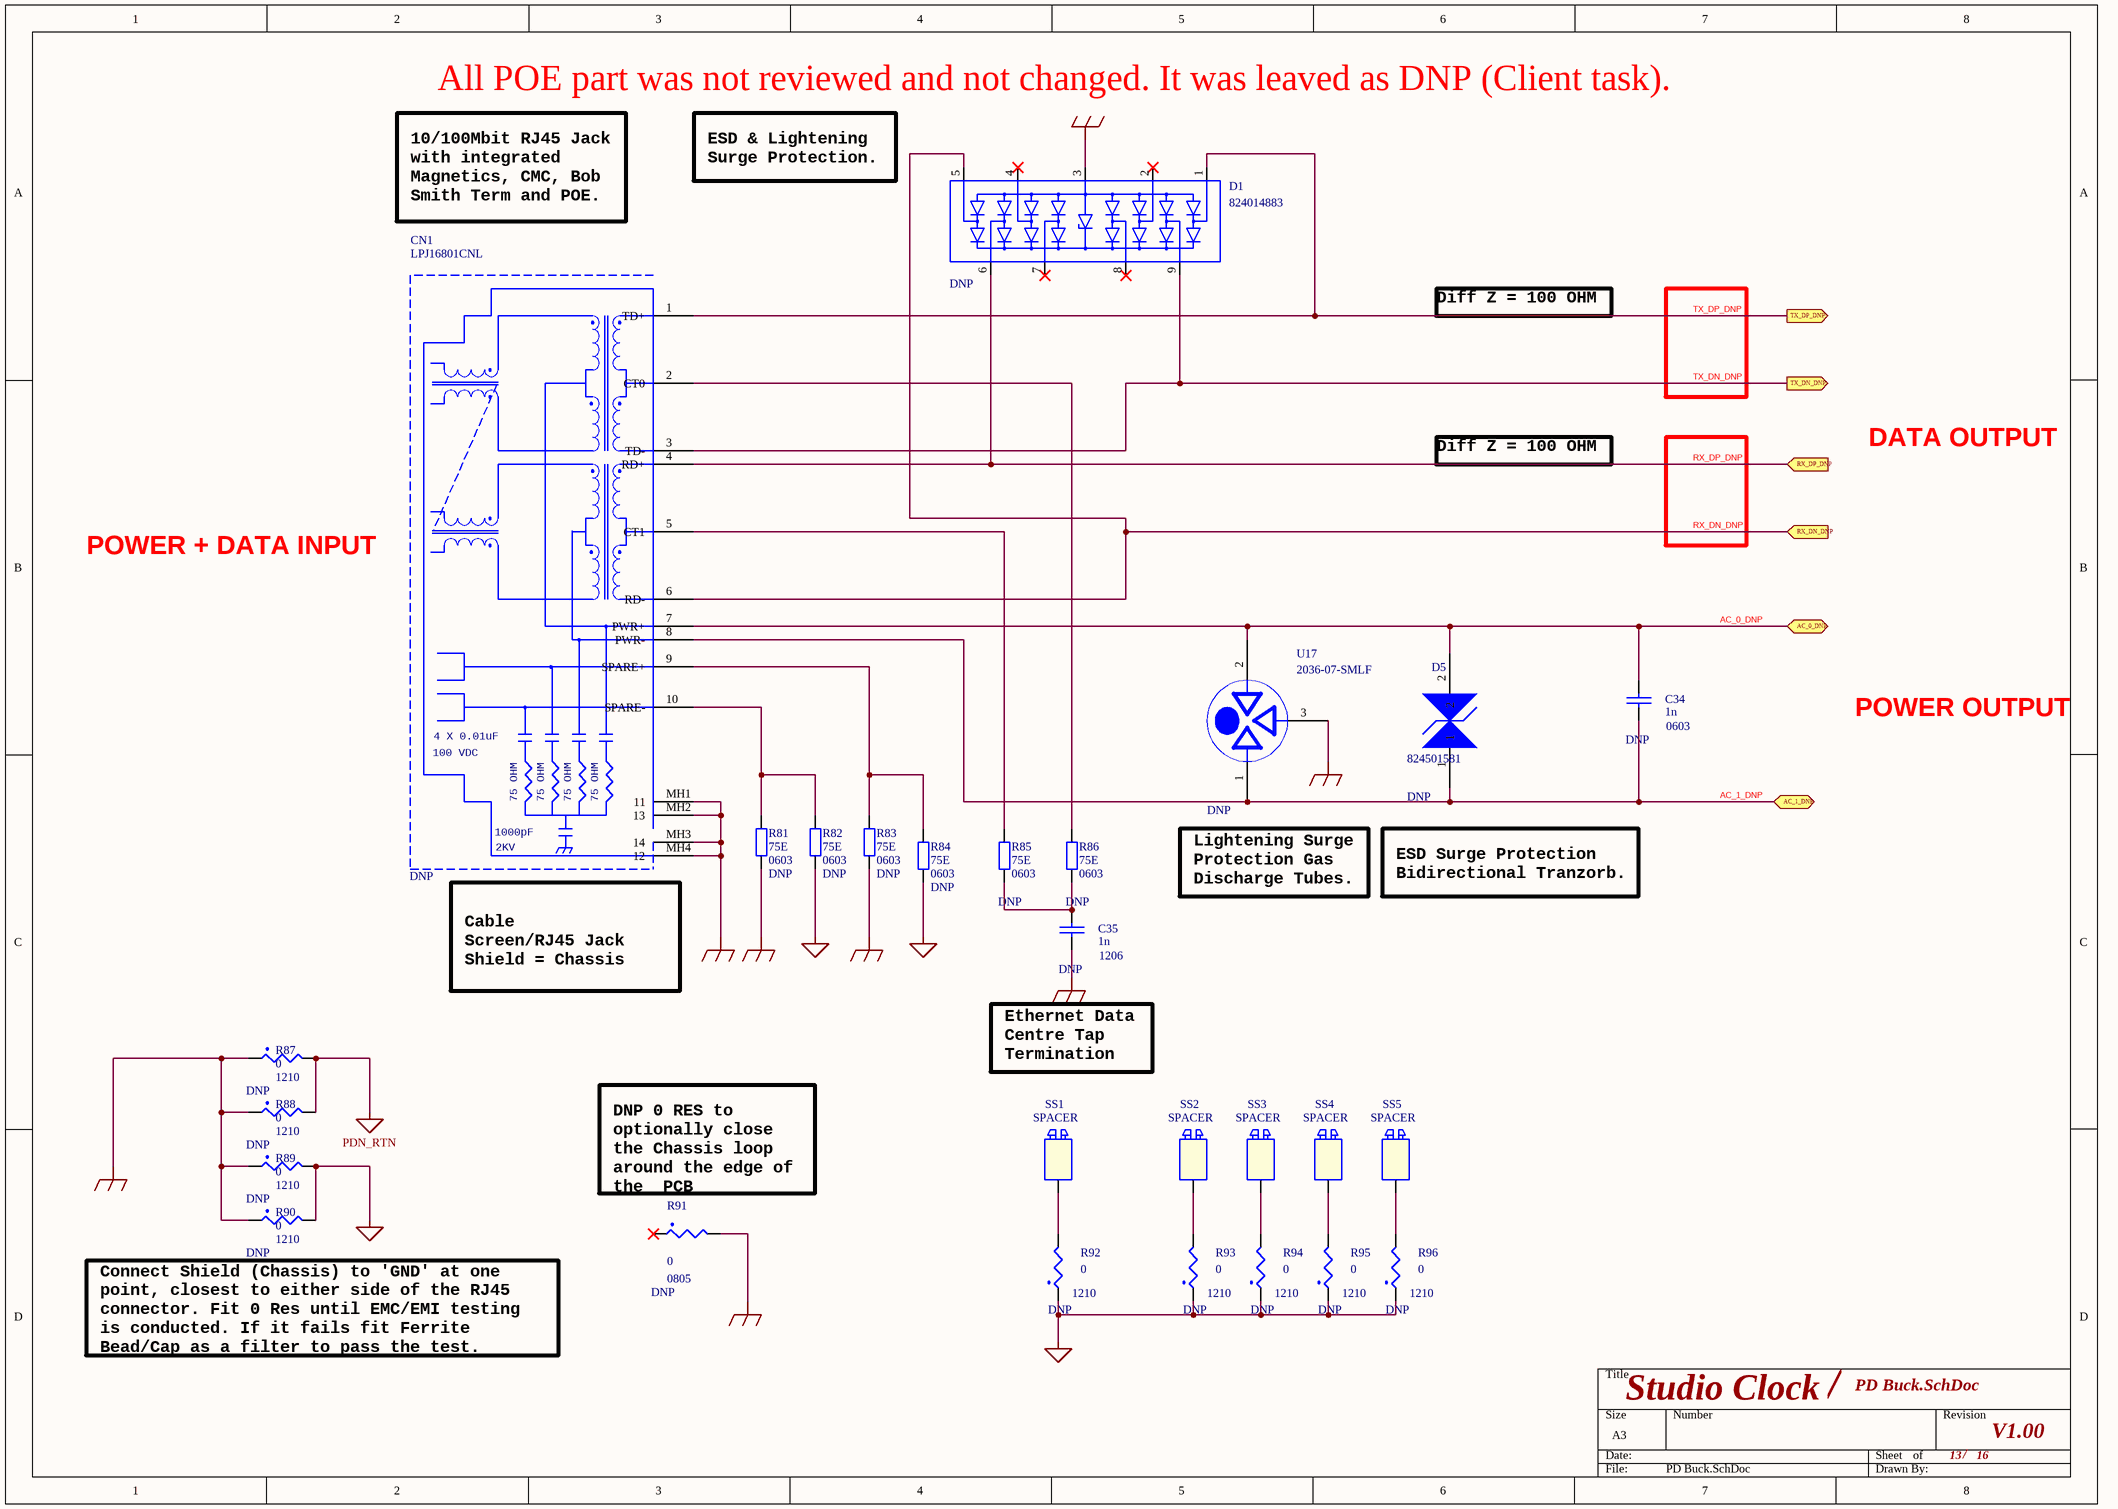
[diagram p12: PD Buck.SchDoc]

### Parts
C34  1n  Foot Print Type: 0603  [c_cs_0603]
C35  1n  Foot Print Type: 1206  [cap_sm_1206]
CN1  LPJ16801CNL  [LPJ16801CNL]
D1  824014883  [TVS_824014883]
D5  824501581  [824501581]
R81  Resistance: 75E  Size2: 0603  PMNT: DNP  [RESC160X80X55L30]  (hidden comment: RC0603FR-0775RP)
R82  Resistance: 75E  Size2: 0603  PMNT: DNP  [RESC160X80X55L30]  (hidden comment: RC0603FR-0775RP)
R83  Resistance: 75E  Size2: 0603  PMNT: DNP  [RESC160X80X55L30]  (hidden comment: RC0603FR-0775RP)
R84  Resistance: 75E  Size2: 0603  PMNT: DNP  [RESC160X80X55L30]  (hidden comment: RC0603FR-0775RP)
R85  Resistance: 75E  Size2: 0603  [RESC160X80X55L30]  (hidden comment: RC0603FR-0775RP)
R86  Resistance: 75E  Size2: 0603  [RESC160X80X55L30]  (hidden comment: RC0603FR-0775RP)
R87  0  Foot Print Size: 1210  [r_sm_1210]
R88  0  Foot Print Size: 1210  [r_sm_1210]
R89  0  Foot Print Size: 1210  [r_sm_1210]
R90  0  Foot Print Size: 1210  [r_sm_1210]
R91  0  Foot Print Size: 0805  [r_sm_0805]
R92  0  Foot Print Size: 1210  [r_sm_1210]
R93  0  Foot Print Size: 1210  [r_sm_1210]
R94  0  Foot Print Size: 1210  [r_sm_1210]
R95  0  Foot Print Size: 1210  [r_sm_1210]
R96  0  Foot Print Size: 1210  [r_sm_1210]
SS1  SPACER  [spacer_139t]
SS2  SPACER  [spacer_139t]
SS3  SPACER  [spacer_139t]
SS4  SPACER  [spacer_139t]
SS5  SPACER  [spacer_139t]
U17  2036-07-SMLF  [CHIP_07-SMLF]

### Ports
AC_0_DNP (bidir), AC_1_DNP (bidir), RX_DN_DNP (in), RX_DP_DNP (in), TX_DN_DNP (out), TX_DP_DNP (out)

### Nets
GND_EARTH: C35.2 CN1.MH1(11) CN1.MH2(13) CN1.MH3(14) CN1.MH4(12) D1.3(GND) R81.1 R83.1 R87.1 R88.1 R89.1 R90.1 R91.2 U17.3
GND_SIGNAL: R82.1 R84.1 R89.2 R90.2 R92.1 R93.1 R94.1 R95.1 R96.1
PDN_RTN: R87.2 R88.2
AC_0_DNP: C34.1 CN1.7(PWR+) D5.2 U17.2 ; port AC_0_DNP
AC_1_DNP: C34.2 CN1.8(PWR-) D5.1 U17.1 ; port AC_1_DNP
RX_DN_DNP: CN1.6(RD-) D1.5(I/O_4) ; port RX_DN_DNP
RX_DP_DNP: CN1.4(RD+) D1.6(I/O_5) ; port RX_DP_DNP
TX_DN_DNP: CN1.3(TD-) D1.9(I/O_8) ; port TX_DN_DNP
TX_DP_DNP: CN1.1(TD+) D1.1(I/O_1) ; port TX_DP_DNP
NetC35_1: C35.1 R85.1 R86.1
NetCN1_2: CN1.2(CT0) R86.2
NetCN1_5: CN1.5(CT1) R85.2
NetCN1_9: CN1.9(SPARE+) R83.2 R84.2
NetCN1_10: CN1.10(SPARE-) R81.2 R82.2
NetR92_2: R92.2 SS1.1(NC_1)
NetR93_2: R93.2 SS2.1(NC_1)
NetR94_2: R94.2 SS3.1(NC_1)
NetR95_2: R95.2 SS4.1(NC_1)
NetR96_2: R96.2 SS5.1(NC_1)

Not connected (* = marked no-connect by the designer): D1 2(I/O_2)* 4(I/O_3)* 7(I/O_6)* 8(I/O_7)*; R91 1*

### Notes on the sheet
- All POE part was not reviewed and not changed. It was leaved as DNP (Client task).
- ESD & Lightening
  Surge Protection.
- 10/100Mbit RJ45 Jack
  with integrated
  Magnetics, CMC, Bob
  Smith Term and POE.
- Diff Z = 100 OHM
- DATA OUTPUT
- POWER + DATA INPUT
- POWER OUTPUT
- Lightening Surge
  Protection Gas
  Discharge Tubes.
- ESD Surge Protection
  Bidirectional Tranzorb.
- Cable
  Screen/RJ45 Jack
  Shield = Chassis
- Ethernet Data
  Centre Tap
  Termination
- (near R91) DNP 0 RES to
  optionally close
  the Chassis loop
  around the edge of
  the  PCB
- (near R90) Connect Shield (Chassis) to 'GND' at one
  point, closest to either side of the RJ45
  connector. Fit 0 Res until EMC/EMI testing
  is conducted. If it fails fit Ferrite
  Bead/Cap as a filter to pass the test.
- /
- (in symbol LPJ16801CNL) 4 X 0.01uF; 100 VDC; 75 OHM; 1000pF; 2KV

### Library data of the parts
C34 = CAP_NP: as C41 on sheet POE_PD; PCB Footprint: c_cs_0603; DNP: DNP
C35 = CAP_NP: as C42 on sheet POE_PD; PCB Footprint: cap_sm_1206; DNP: DNP
D1 = 824014883: OriginalSymbolOrigin: (-30000,100000); PCB Footprint: TVS_824014883; DNP: DNP
R81-R86 = CMP-001-0628-7: RES 75 OHM 1% 1/10W 0603; Manufacturer: YAGEO; Power: 100mW; Temperature Coefficient: ±100ppm; Op Temp max: 155°C; Op Temp min: -55°C; Ratings: -; ComponentLink3URL: https://www.digikey.com/en/products/detail/yageo/RC0603FR-0710KL/726880?s=N4IgTCBcDaIEoGEAMA2JBmAYnAtEg7AIxIDSAMiALoC%2BQA; Size: 1.60mm x 0.80mm; ComponentLink1Description: Datasheet; ComponentLink3Description: Digikey; ComponentLink2Description: Mouser; ComponentLink1URL: https://www.yageo.com/upload/media/product/products/datasheet/rchip/PYu-RC_51_RoHS_P_4.pdf; Composition: Thick Film; Package: 0603 (1608 Metric); ComponentLink2URL: https://eu.mouser.com/ProductDetail/YAGEO/RC0603FR-0710KL?qs=grNVn54RoB%252B3GtjbJj3wJQ%3D%3D; Mounting Type: SM; Tolerance: 1%; Height max: 550µm; MPN: RC0603FR-0775RP; Component Type: Chip Resistor
  R85 R86: DNP: DNP
R87-R90 R92-R96 = SMD_RESISTOR: Tollerance: 5%; Voltage: 50V; PCB Footprint: r_sm_1210; DNP: DNP
R91 = SMD_RESISTOR: Voltage: 50V; Tollerance: 5%; PCB Footprint: r_sm_0805; DNP: DNP
SS1-SS5 = SPACER: CLASS: IC; PCB Footprint: spacer_139t
U17 = 2036-07-SMLF: Mfr_Name: Bourns Electronics; Copyright: Copyright (C) 2022 Ultra Librarian. All rights reserved.; Manufacturer_Part_Number: 2036-07-SMLF; PCB Footprint: CHIP_07-SMLF; DNP: DNP
CN1 = LPJ16801CNL: Part No: LPJ16801CNL; PCB Footprint: LPJ16801CNL; DNP: DNP
D5 = 824501581: PCB Footprint: 824501581; DNP: DNP